# Altium project PowerPanel.PrjPcb (part 1 of 2)
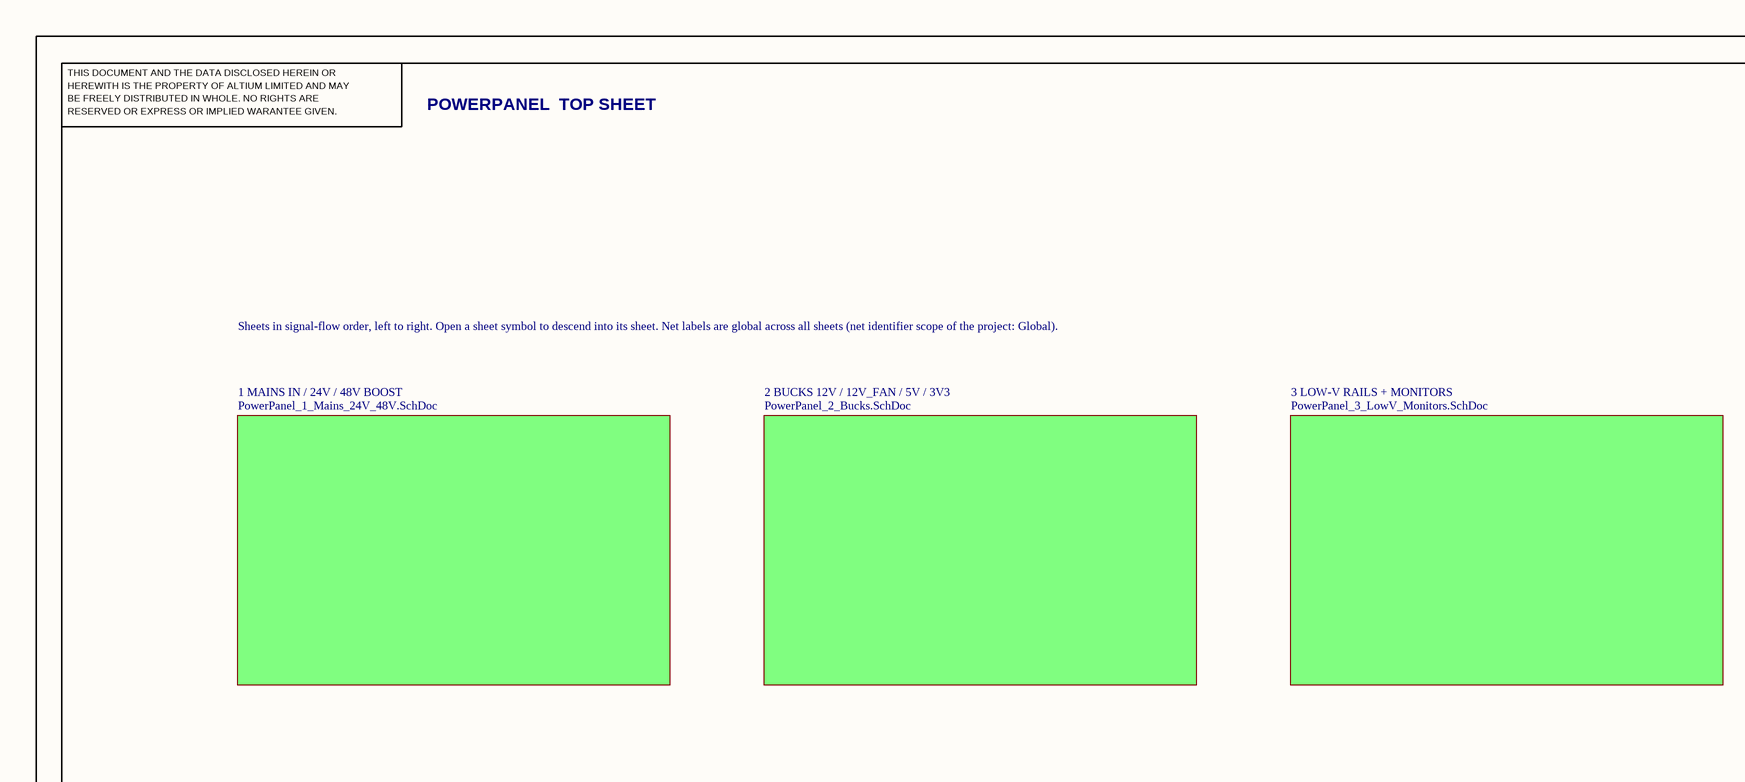
[diagram p0: PowerPanel_0_Top.SchDoc, top left]
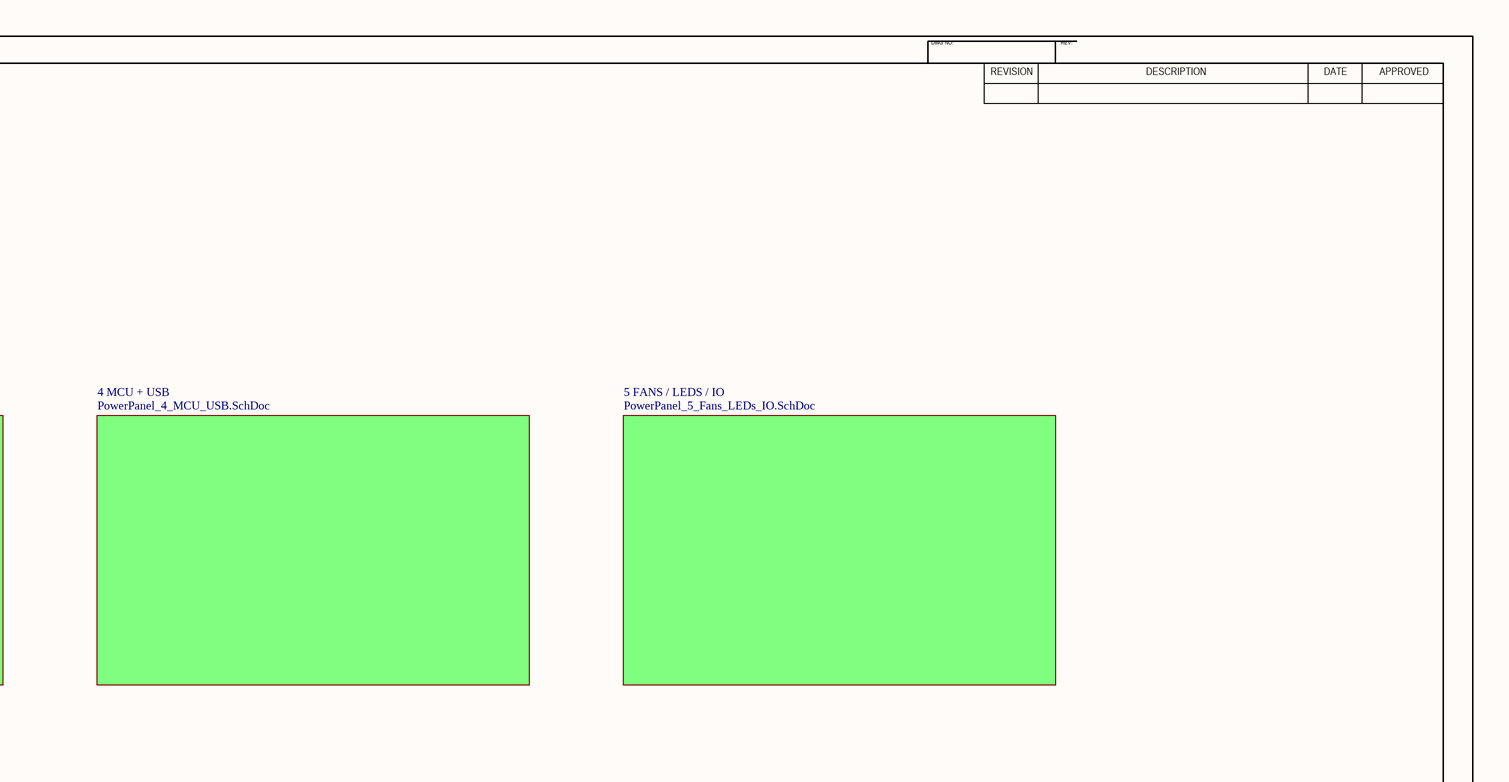
[diagram p1: PowerPanel_0_Top.SchDoc, top right]
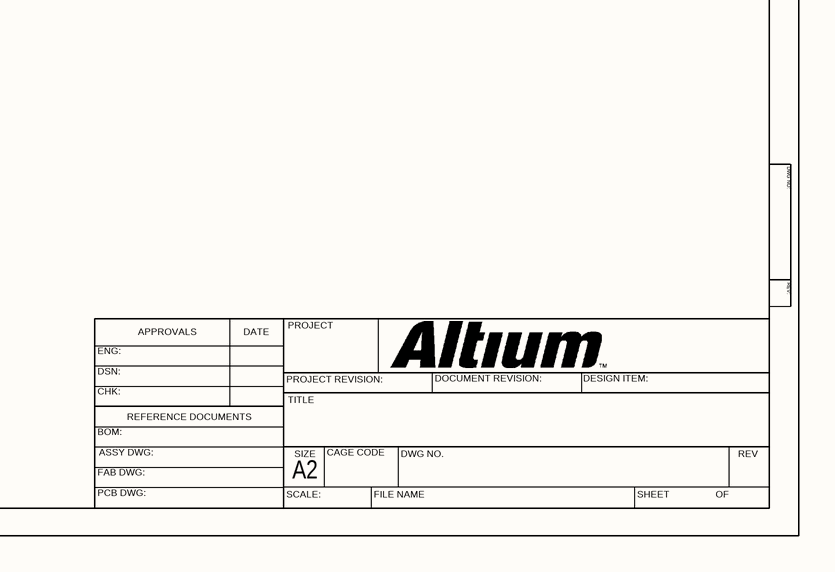
[diagram p2: PowerPanel_0_Top.SchDoc, bottom right]
6 sheets, 342 parts. Net scope: global (net labels, ports and power ports of the same name join across sheets).
Board file: PowerPanel.PcbDoc
Sheets:
  PowerPanel_0_Top.SchDoc
    1 MAINS IN / 24V / 48V BOOST = PowerPanel_1_Mains_24V_48V.SchDoc
    2 BUCKS 12V / 12V_FAN / 5V / 3V3 = PowerPanel_2_Bucks.SchDoc
    3 LOW-V RAILS + MONITORS = PowerPanel_3_LowV_Monitors.SchDoc
    4 MCU + USB = PowerPanel_4_MCU_USB.SchDoc
    5 FANS / LEDS / IO = PowerPanel_5_Fans_LEDs_IO.SchDoc

## Sheet PowerPanel_0_Top.SchDoc
size 594 x 420 mm; SheetNumber: 1; SheetTotal: 6

### Sub-sheets
1 MAINS IN / 24V / 48V BOOST = PowerPanel_1_Mains_24V_48V.SchDoc: no entries
2 BUCKS 12V / 12V_FAN / 5V / 3V3 = PowerPanel_2_Bucks.SchDoc: no entries
3 LOW-V RAILS + MONITORS = PowerPanel_3_LowV_Monitors.SchDoc: no entries
4 MCU + USB = PowerPanel_4_MCU_USB.SchDoc: no entries
5 FANS / LEDS / IO = PowerPanel_5_Fans_LEDs_IO.SchDoc: no entries

### Notes on the sheet
- DWG NO:
- REV:
- THIS DOCUMENT AND THE DATA DISCLOSED HEREIN OR
- HEREWITH IS THE PROPERTY OF ALTIUM LIMITED AND MAY
- BE FREELY DISTRIBUTED IN WHOLE. NO RIGHTS ARE
- RESERVED OR EXPRESS OR IMPLIED WARANTEE GIVEN.
- POWERPANEL  TOP SHEET
- REVISION
- DESCRIPTION
- DATE
- APPROVED
- Sheets in signal-flow order, left to right. Open a sheet symbol to descend into its sheet. Net labels are global across all sheets (net identifier scope of the project: Global).
- ENG:
- APPROVALS
- PROJECT
- DSN:
- CHK:
- REFERENCE DOCUMENTS
- PROJECT REVISION:
- TITLE
- DOCUMENT REVISION:
- DESIGN ITEM:
- BOM:
- FAB DWG:
- PCB DWG:
- ASSY DWG:
- SCALE:
- A2
- SIZE
- CAGE CODE
- FILE NAME
- DWG NO.
- SHEET
- OF
- REV

## Sheet PowerPanel_1_Mains_24V_48V.SchDoc
size 594 x 420 mm; SheetNumber: 2; SheetTotal: 6
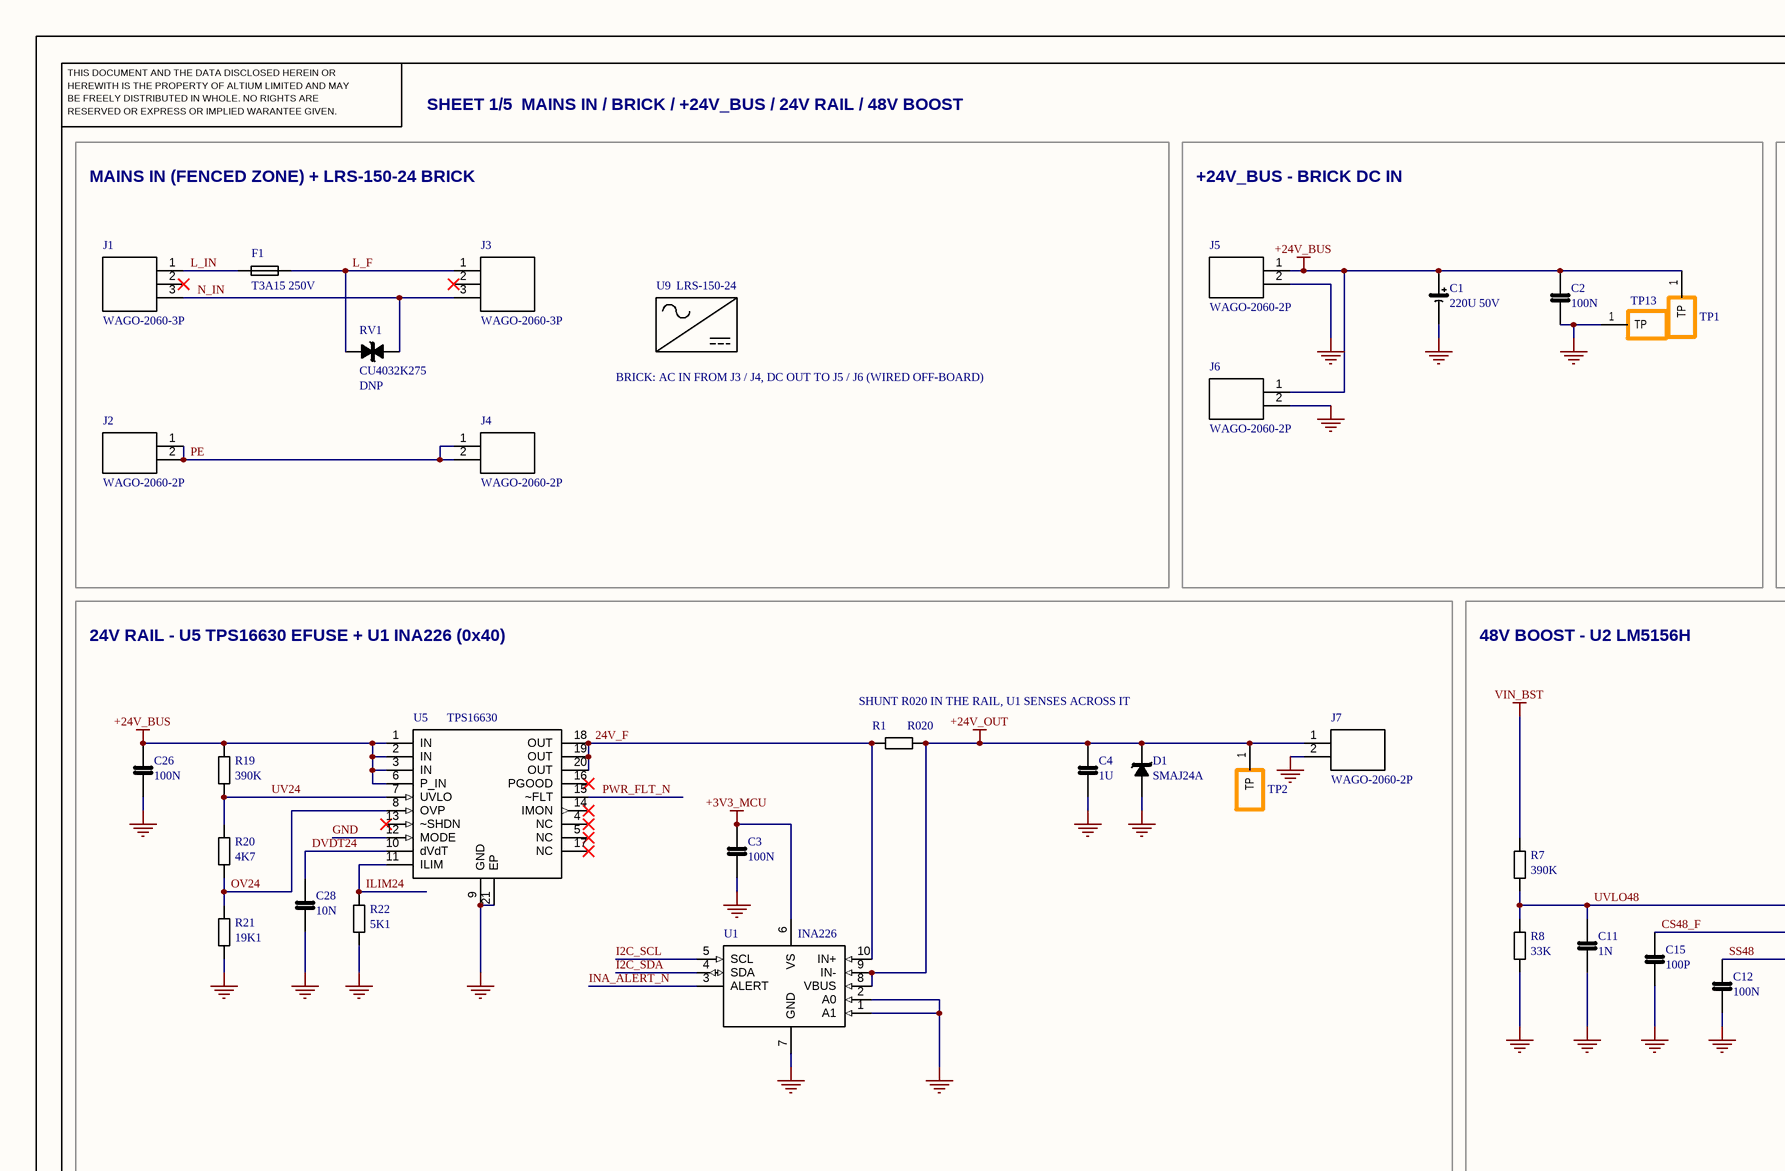
[diagram p3: PowerPanel_1_Mains_24V_48V.SchDoc, top left]
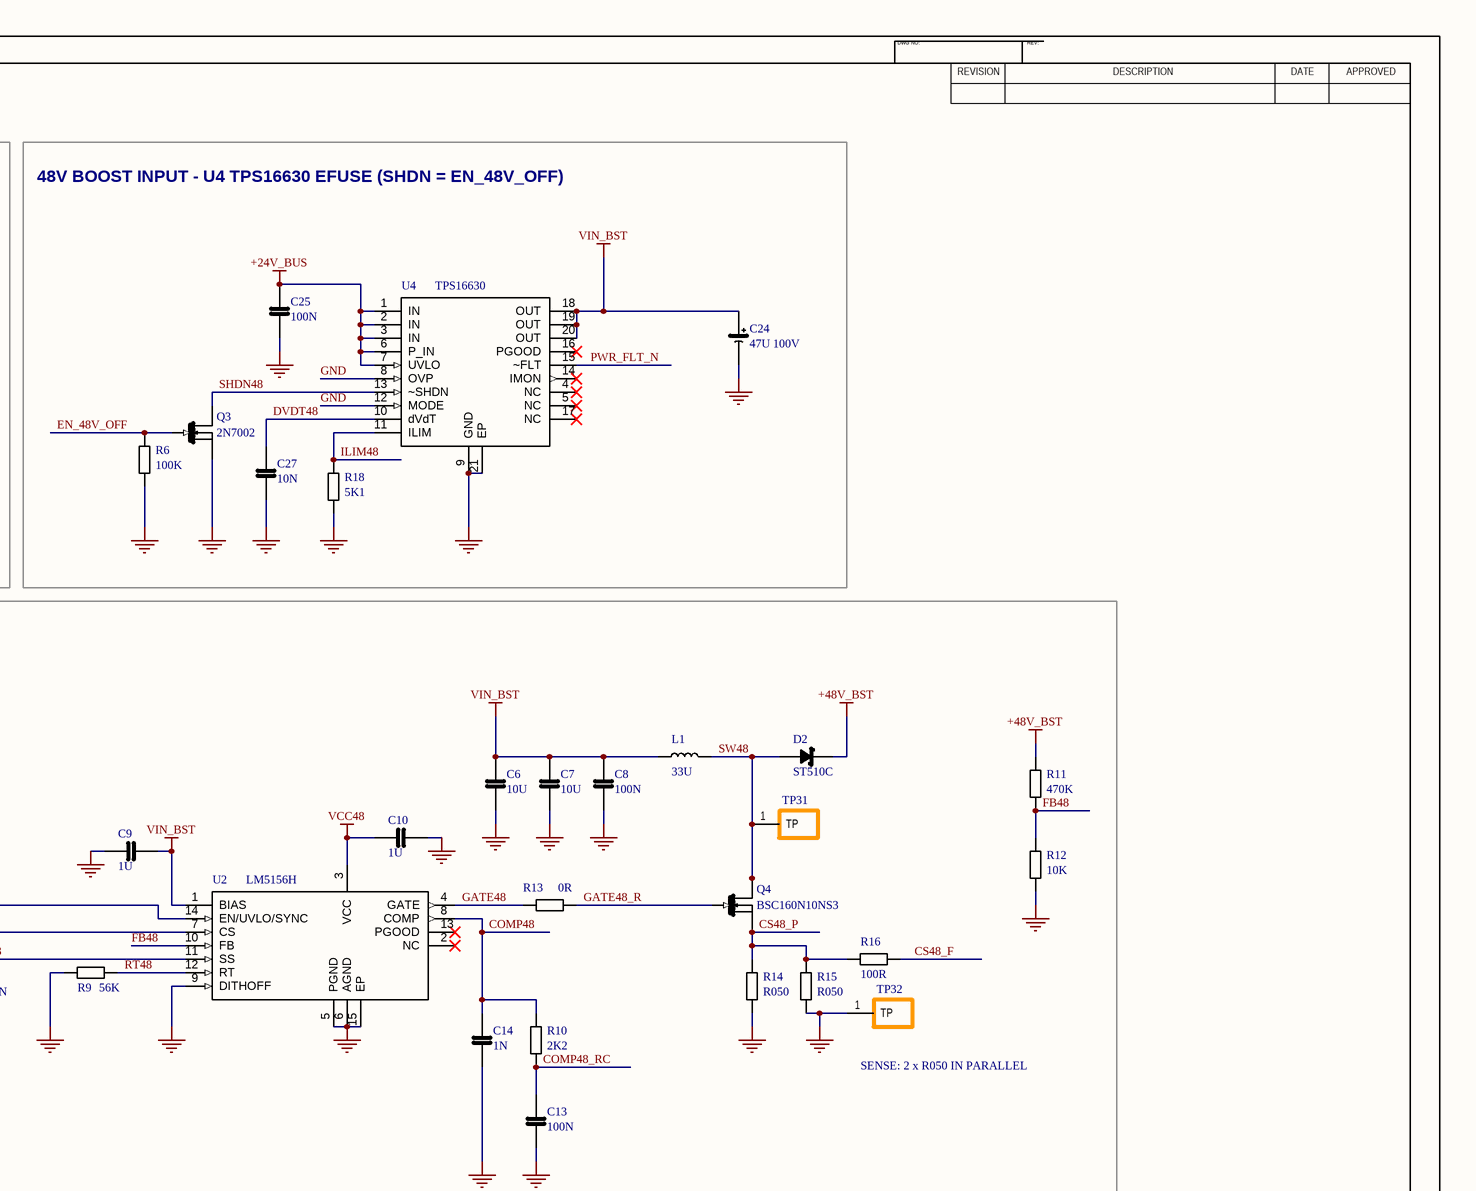
[diagram p4: PowerPanel_1_Mains_24V_48V.SchDoc, top right]
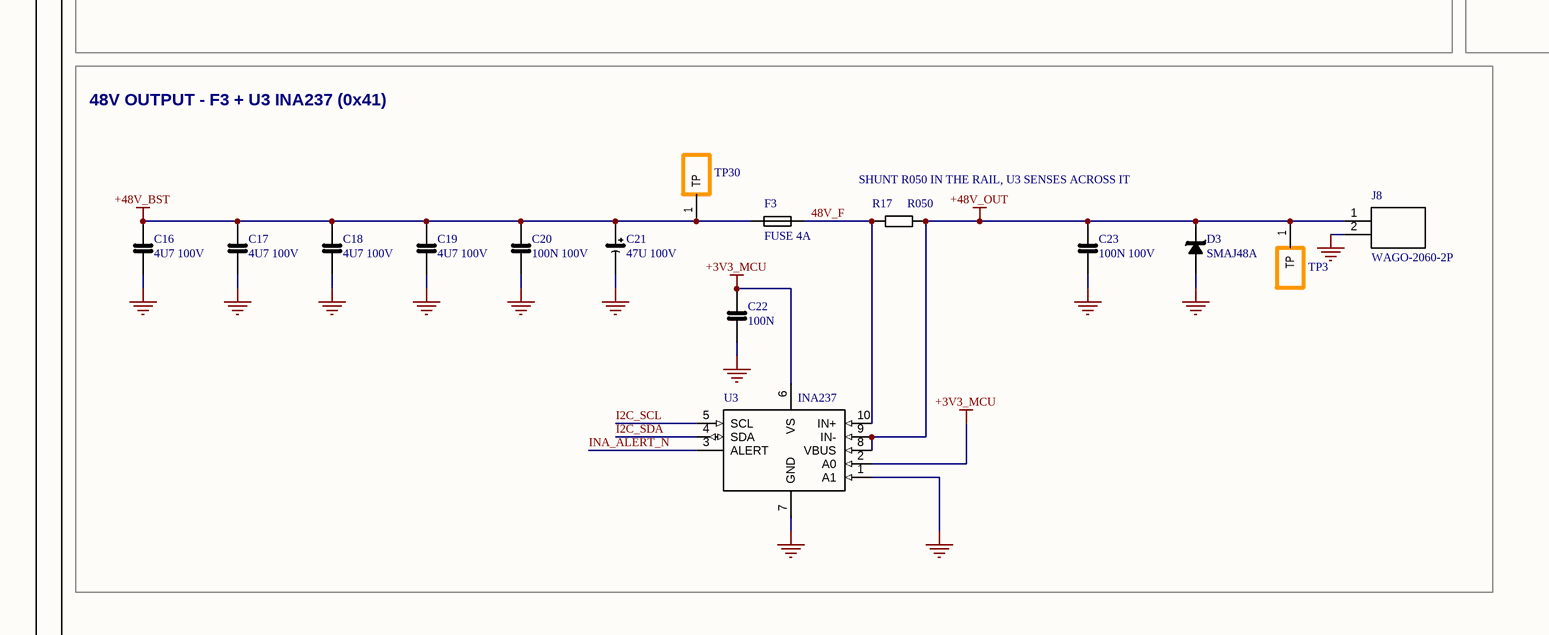
[diagram p5: PowerPanel_1_Mains_24V_48V.SchDoc, bottom left]
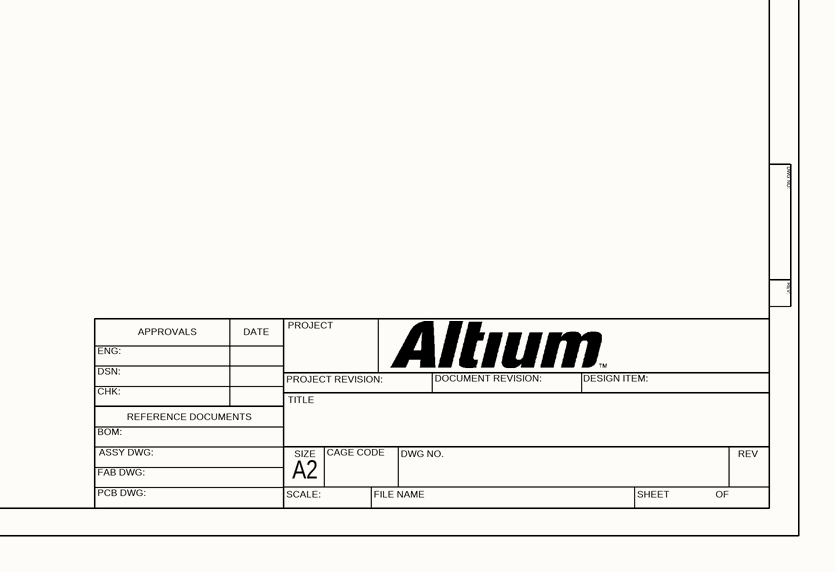
[diagram p6: PowerPanel_1_Mains_24V_48V.SchDoc, bottom right]

### Parts
C1  220U 50V  [CAPAE_D10X10.5]
C2  100N  [CAP0603]
C3  100N  [CAP0603]
C4  1U  [CAP0805]
C6  10U  [CAP1206]
C7  10U  [CAP1206]
C8  100N  [CAP0603]
C9  1U  [CAP0805]
C10  1U  [CAP0603]
C11  1N  [CAP0603]
C12  100N  [CAP0603]
C13  100N  [CAP0603]
C14  1N  [CAP0603]
C15  100P  [CAP0603]
C16  4U7 100V  [CAP1210]
C17  4U7 100V  [CAP1210]
C18  4U7 100V  [CAP1210]
C19  4U7 100V  [CAP1210]
C20  100N 100V  [CAP0603]
C21  47U 100V  [CAPAE_D8X10.5]
C22  100N  [CAP0603]
C23  100N 100V  [CAP0603]
C24  47U 100V  [CAPAE_D8X10.5]
C25  100N  [CAP0603]
C26  100N  [CAP0603]
C27  10N  [CAP0603]
C28  10N  [CAP0603]
D1  SMAJ24A  [SMA]
D2  ST510C  [SMC]
D3  SMAJ48A  [SMA]
F1  T3A15 250V  [FUSE_SCT1032]
F3  FUSE 4A  [FUSE1206]
J1  WAGO-2060-3P  [TERM_WAGO_2060-453]
J2  WAGO-2060-2P  [TERM_WAGO_2060-452]
J3  WAGO-2060-3P  [TERM_WAGO_2060-453]
J4  WAGO-2060-2P  [TERM_WAGO_2060-452]
J5  WAGO-2060-2P  [TERM_WAGO_2060-452]
J6  WAGO-2060-2P  [TERM_WAGO_2060-452]
J7  WAGO-2060-2P  [TERM_WAGO_2060-452]
J8  WAGO-2060-2P  [TERM_WAGO_2060-452]
L1  33U  [IND_MWSA1206S]
Q3  2N7002  [SOT-23-3]
Q4  BSC160N10NS3  [TDSON-8_5X6_EP]
R1  R020  [R1206]
R6  100K  [R0603]
R7  390K  [R0603]
R8  33K  [R0603]
R9  56K  [R0603]
R10  2K2  [R0603]
R11  470K  [R0603]
R12  10K  [R0603]
R13  0R  [R0603]
R14  R050  [R1206]
R15  R050  [R1206]
R16  100R  [R0603]
R17  R050  [R1206]
R18  5K1  [R0603]
R19  390K  [R0603]
R20  4K7  [R0603]
R21  19K1  [R0603]
R22  5K1  [R0603]
RV1  CU4032K275  [VAR_CU4032]
TP1  TP  [TESTPOINT]  (value not drawn)
TP2  TP  [TESTPOINT]  (value not drawn)
TP3  TP  [TESTPOINT]  (value not drawn)
TP13  TP  [TESTPOINT]  (value not drawn)
TP30  TP  [TESTPOINT]  (value not drawn)
TP31  TP  [TESTPOINT]  (value not drawn)
TP32  TP  [TESTPOINT]  (value not drawn)
U1  INA226  [MSOP-10]
U2  LM5156H  [HTSSOP-14_5X4.4_EP]
U3  INA237  [MSOP-10]
U4  TPS16630  [HTSSOP-20_6.5X4.4_EP]
U5  TPS16630  [HTSSOP-20_6.5X4.4_EP]
U9  LRS-150-24  [PSU_MW-LRS-150_CASE241A]

### Blocks framed on the sheet
MAINS IN (FENCED ZONE) + LRS-150-24 BRICK: F1 J1-J4 RV1 U9
+24V_BUS - BRICK DC IN: C1 C2 J5 J6 TP1 TP13
48V BOOST INPUT - U4 TPS16630 EFUSE (SHDN = EN_48V_OFF): C24 C25 C27 Q3 R6 R18 U4
24V RAIL - U5 TPS16630 EFUSE + U1 INA226 (0x40): C3 C4 C26 C28 D1 J7 R1 R19-R22 TP2 U1 U5
48V BOOST - U2 LM5156H: C6-C15 D2 L1 Q4 R7-R16 TP31 TP32 U2
48V OUTPUT - F3 + U3 INA237 (0x41): C16-C23 D3 F3 J8 R17 TP3 TP30 U3

### Nets
+3V3_MCU: C3.1 C22.1 U1.6(VS) U3.2(A0) U3.6(VS)
+24V_BUS: C1.1(+) C2.1 C25.1 C26.1 J5.1 J6.1 R19.1 TP1.1(TP) U4.1(IN) U4.2(IN) U4.3(IN) U4.6(P_IN) U4.7(UVLO) U5.1(IN) U5.2(IN) U5.3(IN) U5.6(P_IN)
+24V_OUT: C4.1 D1.1(K) J7.1 R1.2 TP2.1(TP) U1.8(VBUS) U1.9(IN-)
+48V_BST: C16.1 C17.1 C18.1 C19.1 C20.1 C21.1(+) D2.1(K) F3.1 R11.1 TP30.1(TP)
+48V_OUT: C23.1 D3.1(K) J8.1 R17.2 TP3.1(TP) U3.8(VBUS) U3.9(IN-)
GND: C1.2(-) C2.2 C3.2 C4.2 C6.2 C7.2 C8.2 C9.2 C10.2 C11.2 C12.2 C13.2 C14.2 C15.2 C16.2 C17.2 C18.2 C19.2 C20.2 C21.2(-) C22.2 C23.2 C24.2(-) C25.2 C26.2 C27.2 C28.2 D1.2(A) D3.2(A) J5.2 J6.2 J7.2 J8.2 Q3.2(S) R6.2 R8.2 R9.2 R12.2 R14.2 R15.2 R18.2 R21.2 R22.2 TP13.1(TP) TP32.1(TP) U1.1(A1) U1.2(A0) U1.7(GND) U2.5(PGND) U2.6(AGND) U2.9(DITHOFF) U2.15(EP) U3.1(A1) U3.7(GND) U4.8(OVP) U4.9(GND) U4.12(MODE) U4.21(EP) U5.9(GND) U5.12(MODE) U5.21(EP)
VCC48: C10.1 U2.3(VCC)
VIN_BST: C6.1 C7.1 C8.1 C9.1 C24.1(+) L1.1 R7.1 U2.1(BIAS) U4.18(OUT) U4.19(OUT) U4.20(OUT)
24V_F: R1.1 U1.10(IN+) U5.18(OUT) U5.19(OUT) U5.20(OUT)
48V_F: F3.2 R17.1 U3.10(IN+)
COMP48: C14.1 R10.1 U2.8(COMP)
COMP48_RC: C13.1 R10.2
CS48_F: C15.1 R16.2 U2.7(CS)
CS48_P: Q4.1(S) Q4.2(S) Q4.3(S) R14.1 R15.1 R16.1
DVDT24: C28.1 U5.10(dVdT)
DVDT48: C27.1 U4.10(dVdT)
EN_48V_OFF: Q3.1(G) R6.1
FB48: R11.2 R12.1 U2.10(FB)
GATE48: R13.1 U2.4(GATE)
GATE48_R: Q4.4(G) R13.2
I2C_SCL: U1.5(SCL) U3.5(SCL)
I2C_SDA: U1.4(SDA) U3.4(SDA)
ILIM24: R22.1 U5.11(ILIM)
ILIM48: R18.1 U4.11(ILIM)
INA_ALERT_N: U1.3(ALERT) U3.3(ALERT)
L_F: F1.2 J3.1 RV1.1
L_IN: F1.1 J1.1
N_IN: J1.3 J3.3 RV1.2
OV24: R20.2 R21.1 U5.8(OVP)
PE: J2.1 J2.2 J4.1 J4.2
PWR_FLT_N: U4.15(~FLT) U5.15(~FLT)
RT48: R9.1 U2.12(RT)
SHDN48: Q3.3(D) U4.13(~SHDN)
SS48: C12.1 U2.11(SS)
SW48: D2.2(A) L1.2 Q4.5(D) Q4.6(D) Q4.7(D) Q4.8(D) Q4.9(D) TP31.1(TP)
UV24: R19.2 R20.1 U5.7(UVLO)
UVLO48: C11.1 R7.2 R8.1 U2.14(EN/UVLO/SYNC)

Not connected (* = marked no-connect by the designer): J1 2*; J3 2*; U2 2(NC)* 13(PGOOD)*; U4 4(NC)* 5(NC)* 14(IMON)* 16(PGOOD)* 17(NC)*; U5 4(NC)* 5(NC)* 13(~SHDN)* 14(IMON)* 16(PGOOD)* 17(NC)*

### Notes on the sheet
- DWG NO:
- REV:
- THIS DOCUMENT AND THE DATA DISCLOSED HEREIN OR
- HEREWITH IS THE PROPERTY OF ALTIUM LIMITED AND MAY
- BE FREELY DISTRIBUTED IN WHOLE. NO RIGHTS ARE
- RESERVED OR EXPRESS OR IMPLIED WARANTEE GIVEN.
- SHEET 1/5  MAINS IN / BRICK / +24V_BUS / 24V RAIL / 48V BOOST
- REVISION
- DESCRIPTION
- DATE
- APPROVED
- (near U9) BRICK: AC IN FROM J3 / J4, DC OUT TO J5 / J6 (WIRED OFF-BOARD)
- (near R1) SHUNT R020 IN THE RAIL, U1 SENSES ACROSS IT
- (near TP32) SENSE: 2 x R050 IN PARALLEL
- (near R17) SHUNT R050 IN THE RAIL, U3 SENSES ACROSS IT
- ENG:
- APPROVALS
- PROJECT
- DSN:
- CHK:
- REFERENCE DOCUMENTS
- PROJECT REVISION:
- TITLE
- DOCUMENT REVISION:
- DESIGN ITEM:
- BOM:
- FAB DWG:
- PCB DWG:
- ASSY DWG:
- SCALE:
- A2
- SIZE
- CAGE CODE
- FILE NAME
- DWG NO.
- SHEET
- OF
- REV

### Library data of the parts
C1 = CP_220U_50V_10X10: CAP ALU // 220U // 50V // 20% // 105C // SMD D10X10.5; MFR: jieerrui; MPN: JVJ50V220M10x10; Value: 220U; LCSC: C46550417; JLC_TYPE: EXTENDED; JLC_CHECKED: 2026-10-03 STOCK 197742; Datasheet: https://www.lcsc.com/datasheet/lcsc_datasheet_2504101957_jieerrui-JVJ16V470M6x8_C46550400.pdf
C2 C3 C8 C12 C13 C22 C25 C26 = C_100N_0603: CAP // 100N // 50V // X7R // 0603; MFR: YAGEO; MPN: CC0603KRX7R9BB104; Value: 100N; LCSC: C14663; JLC_TYPE: BASIC; JLC_CHECKED: 2026-09-29 STOCK 55887132; Datasheet: https://www.lcsc.com/datasheet/lcsc_datasheet_2211101700_YAGEO-CC0603KRX7R9BB104_C14663.pdf
C4 C9 = C_1U_0805: CAP // 1U // 50V // X7R // 0805; MFR: Samsung Electro-Mechanics; MPN: CL21B105KBFNNNE; Value: 1U; LCSC: C28323; JLC_TYPE: BASIC; JLC_CHECKED: 2026-09-29 STOCK 2359989; Datasheet: https://www.lcsc.com/datasheet/lcsc_datasheet_2304140030_Samsung-Electro-Mechanics-CL21B105KBFNNNE_C28323.pdf
C6 C7 = C_10U_1206: CAP // 10U // 50V // X5R // 1206; MFR: Samsung Electro-Mechanics; MPN: CL31A106KBHNNNE; Value: 10U; LCSC: C13585; JLC_TYPE: BASIC; JLC_CHECKED: 2026-09-29 STOCK 2442079; Datasheet: https://www.lcsc.com/datasheet/lcsc_datasheet_2304140030_Samsung-Electro-Mechanics-CL31A106KBHNNNE_C13585.pdf
C10 = C_1U_0603: CAP // 1U // 50V // X5R // 0603; MFR: Samsung Electro-Mechanics; MPN: CL10A105KB8NNNC; Value: 1U; LCSC: C15849; JLC_TYPE: BASIC; JLC_CHECKED: 2026-09-29 STOCK 6435528; Datasheet: https://www.lcsc.com/datasheet/lcsc_datasheet_2304140030_Samsung-Electro-Mechanics-CL10A105KB8NNNC_C15849.pdf
C11 C14 = C_1N_0603: CAP // 1N // 50V // X7R // 0603; MFR: Samsung Electro-Mechanics; MPN: CL10B102KB8NNNC; Value: 1N; LCSC: C1588; JLC_TYPE: BASIC; JLC_CHECKED: 2026-09-29 STOCK 7937326; Datasheet: https://www.lcsc.com/datasheet/lcsc_datasheet_2304140030_Samsung-Electro-Mechanics-CL10B102KB8NNNC_C1588.pdf
C15 = C_100P_0603: CAP // 100P // 50V // C0G // 0603; MFR: Samsung Electro-Mechanics; MPN: CL10C101JB8NNNC; Value: 100P; LCSC: C14858; JLC_TYPE: BASIC; JLC_CHECKED: 2026-09-29 STOCK 4024635; Datasheet: https://www.lcsc.com/datasheet/lcsc_datasheet_2304140030_Samsung-Electro-Mechanics-CL10C101JB8NNNC_C14858.pdf
C16-C19 = C_4U7_100V_1210: CAP // 4U7 // 100V // X7R // 1210; MFR: PSA(Prosperity Dielectrics); MPN: FS32X475K101EGG; Value: 4U7; LCSC: C381466; JLC_TYPE: EXTENDED; JLC_CHECKED: 2026-10-03 STOCK 171506; Datasheet: https://wmsc.lcsc.com/wmsc/upload/file/pdf/v2/lcsc/2304140030_PSA-Prosperity-Dielectrics-FS32X475K101EGG_C381466.pdf
C20 C23 = C_100N_100V_0603: CAP // 100N // 100V // X7R // 0603; MFR: Samsung Electro-Mechanics; MPN: CL10B104KC8NNNC; Value: 100N; LCSC: C15725; JLC_TYPE: EXTENDED; JLC_CHECKED: 2026-10-03 STOCK 692214; Datasheet: https://www.lcsc.com/datasheet/lcsc_datasheet_2304140030_Samsung-Electro-Mechanics-CL10B104KC8NNNC_C15725.pdf
C21 C24 = CP_47U_100V_8X10: CAP ALU // 47U // 100V // 20% // 105C // SMD D8X10.5; MFR: jieerrui; MPN: RV100V47M8X10; Value: 47U; LCSC: C48935391; JLC_TYPE: EXTENDED; JLC_CHECKED: 2026-10-03 STOCK 115676; Datasheet: https://www.lcsc.com/datasheet/lcsc_datasheet_2505151725_jieerrui-RV100V47M8X10_C48935391.pdf
C27 C28 = C_10N_0603: CAP // 10N // 50V // X7R // 0603; MFR: FH (Guangdong Fenghua Advanced Tech); MPN: 0603B103K500NT; Value: 10N; LCSC: C57112; JLC_TYPE: BASIC; JLC_CHECKED: 2026-09-29 STOCK 6903861; Datasheet: https://www.lcsc.com/datasheet/lcsc_datasheet_2304140030_FH--Guangdong-Fenghua-Advanced-Tech-0603B103K500NT_C57112.pdf
D1 = D_SMAJ24A: TVS // 24V UNI // 400W // 38V9 CLAMP // SMA; MFR: hongjiacheng; Value: 24V; MPN: SMAJ24A; LCSC: C19077541; JLC_TYPE: PREFERRED; JLC_CHECKED: 2026-09-29 STOCK 132041; Datasheet: https://wmsc.lcsc.com/wmsc/upload/file/pdf/v2/lcsc/2312280937_hongjiacheng-SMAJ24A_C19077541.pdf
D2 = D_ST510C: SCHOTTKY // 100V 5A // 600MV // 150A IFSM // SMC; MFR: MDD (Microdiode Semiconductor); Value: 100V 5A; MPN: ST510C; LCSC: C414013; JLC_TYPE: EXTENDED; JLC_CHECKED: 2026-10-03 STOCK 2060; Datasheet: https://www.lcsc.com/datasheet/lcsc_datasheet_2408090958_MDD-Microdiode-Semiconductor-ST510C_C414013.pdf
D3 = D_SMAJ48A: TVS // 48V UNI // 400W // 77V4 CLAMP // SMA; MFR: Littelfuse; Value: 48V; MPN: SMAJ48A; LCSC: C223991; JLC_TYPE: EXTENDED; JLC_CHECKED: 2026-10-03 STOCK 5668; Datasheet: https://www.lcsc.com/datasheet/lcsc_datasheet_2304140030_Littelfuse-SMAJ48A_C223991.pdf
F1 = F_T3A15_250V_1032: FUSE // T3.15A TIME-LAG // 250VAC // 100A BREAK // SMD 10.3X3.3; MFR: SETsafe / SETfuse; MPN: SCT1032T3.15A250V; Value: 3A15; LCSC: C19712564; JLC_TYPE: EXTENDED; JLC_CHECKED: 2026-10-03 STOCK 1944; Datasheet: https://wmsc.lcsc.com/wmsc/upload/file/pdf/v2/lcsc/2312181522_SETsafe--/--SETfuse-SCT1032T3-15A250V_C19712564.pdf
F3 = F_4A_63V_1206: FUSE // 4A // FAST // 63V // 50A BREAK // 1206; MFR: Shenzhen JDT Fuse; MPN: JFC1206-1400FS; Value: 4A; LCSC: C136349; JLC_TYPE: EXTENDED; JLC_CHECKED: 2026-10-03 STOCK 45560; Datasheet: https://www.lcsc.com/datasheet/lcsc_datasheet_2305151206_Shenzhen-JDT-Fuse-JFC1206-1400FS_C136349.pdf
J1 J3 = J_TERM-SPRING_3P_4.0_SMD: CONN // WAGO 2060 PUSH-IN // 3P // 4.0MM // 9A 320V // SMD; MPN: 2060-453/998-404; Value: 3P; MFR: WAGO; LCSC: C2765056; JLC_TYPE: EXTENDED; JLC_CHECKED: 2026-10-03 STOCK 1543; Datasheet: https://wmsc.lcsc.com/wmsc/upload/file/pdf/v2/lcsc/2106061734_WAGO-2060-453-998-404_C2765056.pdf
J2 J4-J8 = J_TERM-SPRING_2P_4.0_SMD: CONN // WAGO 2060 PUSH-IN // 2P // 4.0MM // 9A 320V // SMD; MPN: 2060-452/998-404; Value: 2P; MFR: WAGO; LCSC: C2765055; JLC_TYPE: EXTENDED; JLC_CHECKED: 2026-10-03 STOCK 27983; Datasheet: https://wmsc.lcsc.com/wmsc/upload/file/pdf/v2/lcsc/2410121253_WAGO-2060-452-998-404_C2765055.pdf
L1 = L_33U_1350: IND // 33U // ISAT 4.8A // IRMS 4.8A // 75MR // 1350 MOLDED; MFR: Sunlord; MPN: MWSA1206S-330MT; Value: 33U; LCSC: C408530; JLC_TYPE: EXTENDED; JLC_CHECKED: 2026-10-03 STOCK 2989; Datasheet: https://media.digikey.com/pdf/Data%20Sheets/Shenzhen%20Sunlord/MWSA-S_Series_DS.pdf
Q3 = Q_2N7002: NMOS // 60V // 115MA // 5R@10V // SOT-23; MFR: Jiangsu Changjing Electronics Technology Co., Ltd.; Value: 2N7002; MPN: 2N7002; LCSC: C8545; JLC_TYPE: BASIC; JLC_CHECKED: 2026-09-29 STOCK 1679919; Datasheet: https://www.lcsc.com/datasheet/lcsc_datasheet_2304140030_Jiangsu-Changjing-Electronics-Technology-Co---Ltd--2N7002_C8545.pdf
Q4 = Q_BSC160N10NS3G: NMOS // 100V // 42A // 16MR@10V // TDSON-8 5X6; MFR: Infineon Technologies; Value: BSC160N10NS3G; MPN: BSC160N10NS3 G; LCSC: C148261; JLC_TYPE: EXTENDED; JLC_CHECKED: 2026-10-03 STOCK 3614; Datasheet: https://www.lcsc.com/datasheet/lcsc_datasheet_2304140030_Infineon-Technologies-BSC160N10NS3G_C148261.pdf
R1 = R_R020_1206: SHUNT // R020 // 1% // 1W // 70PPM // 1206; MFR: PSA(Prosperity Dielectrics); MPN: FMF06FTHR020-LH; Value: R020; LCSC: C371097; JLC_TYPE: EXTENDED; JLC_CHECKED: 2026-10-03 STOCK 16724; Datasheet: https://www.lcsc.com/datasheet/lcsc_datasheet_2304140030_PSA-Prosperity-Dielectrics-FMF06FTHR020-LH_C371097.pdf
R6 = R_100K_0603: RES // 100K // 1% // 100MW // 0603; MFR: UNI-ROYAL(Uniroyal Elec); MPN: 0603WAF1003T5E; Value: 100K; LCSC: C25803; JLC_TYPE: BASIC; JLC_CHECKED: 2026-09-29 STOCK 22429301; Datasheet: https://www.lcsc.com/datasheet/lcsc_datasheet_2206010045_UNI-ROYAL-Uniroyal-Elec-0603WAF1003T5E_C25803.pdf
R7 R19 = R_390K_0603: RES // 390K // 1% // 100MW // 0603; MFR: UNI-ROYAL(Uniroyal Elec); MPN: 0603WAF3903T5E; Value: 390K; LCSC: C23150; JLC_TYPE: PREFERRED; JLC_CHECKED: 2026-10-03 STOCK 76545; Datasheet: https://www.lcsc.com/datasheet/lcsc_datasheet_2206010116_UNI-ROYAL-Uniroyal-Elec-0603WAF3903T5E_C23150.pdf
R8 = R_33K_0603: RES // 33K // 1% // 100MW // 0603; MFR: UNI-ROYAL(Uniroyal Elec); MPN: 0603WAF3302T5E; Value: 33K; LCSC: C4216; JLC_TYPE: BASIC; JLC_CHECKED: 2026-10-03 STOCK 3235651; Datasheet: https://www.lcsc.com/datasheet/lcsc_datasheet_2206010230_UNI-ROYAL-Uniroyal-Elec-0603WAF3302T5E_C4216.pdf
R9 = R_56K_0603: RES // 56K // 1% // 100MW // 0603; MFR: UNI-ROYAL(Uniroyal Elec); MPN: 0603WAF5602T5E; Value: 56K; LCSC: C23206; JLC_TYPE: BASIC; JLC_CHECKED: 2026-10-03 STOCK 1024608; Datasheet: https://www.lcsc.com/datasheet/lcsc_datasheet_2206010116_UNI-ROYAL-Uniroyal-Elec-0603WAF5602T5E_C23206.pdf
R10 = R_2K2_0603: RES // 2K2 // 1% // 100MW // 0603; MFR: UNI-ROYAL(Uniroyal Elec); MPN: 0603WAF2201T5E; Value: 2K2; LCSC: C4190; JLC_TYPE: BASIC; JLC_CHECKED: 2026-09-29 STOCK 7718232; Datasheet: https://www.lcsc.com/datasheet/lcsc_datasheet_2206010230_UNI-ROYAL-Uniroyal-Elec-0603WAF2201T5E_C4190.pdf
R11 = R_470K_0603: RES // 470K // 1% // 100MW // 0603; MFR: UNI-ROYAL(Uniroyal Elec); MPN: 0603WAF4703T5E; Value: 470K; LCSC: C23178; JLC_TYPE: BASIC; JLC_CHECKED: 2026-10-03 STOCK 1456053; Datasheet: https://www.lcsc.com/datasheet/lcsc_datasheet_2206010116_UNI-ROYAL-Uniroyal-Elec-0603WAF4703T5E_C23178.pdf
R12 = R_10K_0603: RES // 10K // 1% // 100MW // 0603; MFR: UNI-ROYAL(Uniroyal Elec); MPN: 0603WAF1002T5E; Value: 10K; LCSC: C25804; JLC_TYPE: BASIC; JLC_CHECKED: 2026-09-29 STOCK 21309815; Datasheet: https://www.lcsc.com/datasheet/lcsc_datasheet_2206010045_UNI-ROYAL-Uniroyal-Elec-0603WAF1002T5E_C25804.pdf
R13 = R_0R_0603: RES // 0R // JUMPER // 0603; MFR: UNI-ROYAL(Uniroyal Elec); MPN: 0603WAF0000T5E; Value: 0R; LCSC: C21189; JLC_TYPE: BASIC; JLC_CHECKED: 2026-09-29 STOCK 24079380; Datasheet: https://www.lcsc.com/datasheet/lcsc_datasheet_2411221126_UNI-ROYAL-Uniroyal-Elec-0603WAF0000T5E_C21189.pdf
R14 R15 R17 = R_R050_1206: SHUNT // R050 // 1% // 1W // 1206; MFR: Shenzhen Yezhan Elec.; MPN: YLRY06-1-50F; Value: R050; LCSC: C20608719; JLC_TYPE: EXTENDED; JLC_CHECKED: 2026-09-29 STOCK 79173; Datasheet: https://wmsc.lcsc.com/wmsc/upload/file/pdf/v2/lcsc/2401171159_Shenzhen-Yezhan-Elec--YLRY06-1-50F_C20608719.pdf
R16 = R_100R_0603: RES // 100R // 1% // 100MW // 0603; MFR: UNI-ROYAL(Uniroyal Elec); MPN: 0603WAF1000T5E; Value: 100R; LCSC: C22775; JLC_TYPE: BASIC; JLC_CHECKED: 2026-09-29 STOCK 11791812; Datasheet: https://www.lcsc.com/datasheet/lcsc_datasheet_2411221126_UNI-ROYAL-Uniroyal-Elec-0603WAF1000T5E_C22775.pdf
R18 R22 = R_5K1_0603: RES // 5K1 // 1% // 100MW // 0603; MFR: UNI-ROYAL(Uniroyal Elec); MPN: 0603WAF5101T5E; Value: 5K1; LCSC: C23186; JLC_TYPE: BASIC; JLC_CHECKED: 2026-09-29 STOCK 25577365; Datasheet: https://www.lcsc.com/datasheet/lcsc_datasheet_2206010116_UNI-ROYAL-Uniroyal-Elec-0603WAF5101T5E_C23186.pdf
R20 = R_4K7_0603: RES // 4K7 // 1% // 100MW // 0603; MFR: UNI-ROYAL(Uniroyal Elec); MPN: 0603WAF4701T5E; Value: 4K7; LCSC: C23162; JLC_TYPE: BASIC; JLC_CHECKED: 2026-09-29 STOCK 22752027; Datasheet: https://www.lcsc.com/datasheet/lcsc_datasheet_2206010116_UNI-ROYAL-Uniroyal-Elec-0603WAF4701T5E_C23162.pdf
R21 = R_19K1_0603: RES // 19K1 // 1% // 100MW // 0603; MFR: UNI-ROYAL(Uniroyal Elec); MPN: 0603WAF1912T5E; Value: 19K1; LCSC: C22897; JLC_TYPE: EXTENDED; JLC_CHECKED: 2026-10-03 STOCK 64956; Datasheet: https://www.lcsc.com/datasheet/lcsc_datasheet_2206010130_UNI-ROYAL-Uniroyal-Elec-0603WAF1912T5E_C22897.pdf
RV1 = RV_275VAC_SMD10X8: VARISTOR // 430V // 275VAC 350VDC // 1K2A // 710V CLAMP // SMD 10.2X8; MFR: TDK; MPN: B72660M0271K072; Value: 430V; LCSC: C211138; JLC_TYPE: EXTENDED; JLC_CHECKED: 2026-10-03 STOCK 955; Datasheet: https://wmsc.lcsc.com/wmsc/upload/file/pdf/v2/lcsc/2406141752_TDK-B72660M0271K072_C211138.pdf; DNP: DNP
TP1-TP3 TP13 TP30-TP32 = TP: TP // SMD PAD // 1.5MM; MPN: TEST POINT (NOT A BOM PART)
U1 = U_INA226: PWR MON // 36V // 16BIT I2C // ALERT // VSSOP-10; MFR: Texas Instruments; MPN: INA226AIDGSR; Value: INA226; LCSC: C49851; JLC_TYPE: EXTENDED; JLC_CHECKED: 2026-09-29 STOCK 48191; Datasheet: https://www.lcsc.com/datasheet/lcsc_datasheet_2312041157_Texas-Instruments-INA226AIDGSR_C49851.pdf
U2 = U_LM5156H: BOOST CTRL // 2V97-60V // 100K-2M2HZ // NON-HICCUP // HTSSOP-14; MFR: Texas Instruments; MPN: LM5156HPWPR; Value: LM5156H; LCSC: C2867852; JLC_TYPE: EXTENDED; JLC_CHECKED: 2026-10-03 STOCK 3172; Datasheet: https://www.ti.com/lit/ds/symlink/lm5156h.pdf
U3 = U_INA237: PWR MON // 85V // 16BIT I2C // ALERT // VSSOP-10; MFR: Texas Instruments; MPN: INA237AIDGSR; Value: INA237; LCSC: C2864837; JLC_TYPE: EXTENDED; JLC_CHECKED: 2026-10-03 STOCK 5235; Datasheet: https://www.ti.com/lit/ds/symlink/ina237.pdf
U4 U5 = U_TPS16630PWP: EFUSE // 4V5-60V // 6A // 31MR // UVLO OVP // HTSSOP-20; MFR: Texas Instruments; MPN: TPS16630PWPR; Value: TPS16630; LCSC: C1849461; JLC_TYPE: EXTENDED; JLC_CHECKED: 2026-10-03 STOCK 1141; Datasheet: https://www.ti.com/lit/ds/symlink/tps1663.pdf
U9 = PSU_LRS-150-24: PSU // AC-DC // 24V 6.5A // 150W // CASE 241A 159X97X30 // HAND FITTED; MFR: Mean Well; Value: 24V 150W; Assembly: HAND - BOUGHT SEPARATELY, SCREWED ON + WIRED AFTER PCBA (NOT JLC); BOM_Extra: KAPTON SHEET >=165X103X0.1MM UNDER THE BRICK + 2X M3X4 SCREWS (WAFER HEAD OR ISO 10642, A-HV5); MPN: LRS-150-24; Datasheet: https://www.meanwell.com/Upload/PDF/LRS-150/LRS-150-SPEC.PDF

## Sheet PowerPanel_2_Bucks.SchDoc
size 594 x 420 mm; SheetNumber: 3; SheetTotal: 6
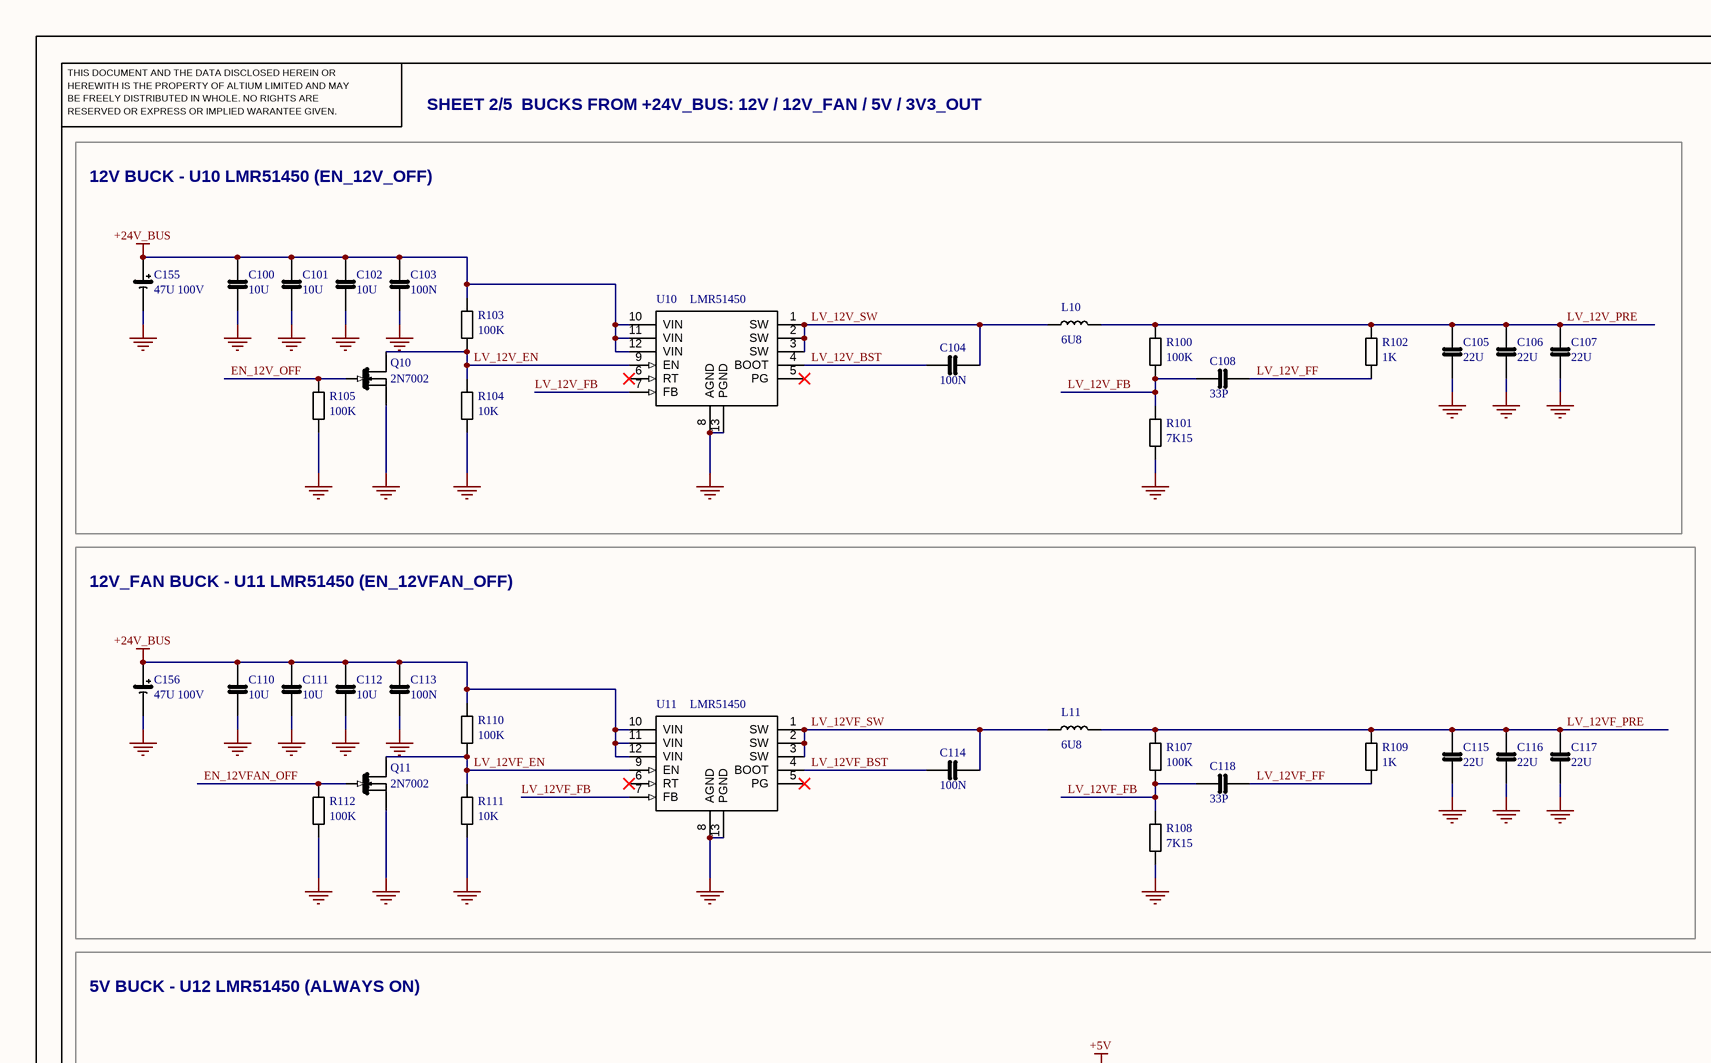
[diagram p7: PowerPanel_2_Bucks.SchDoc, top left]
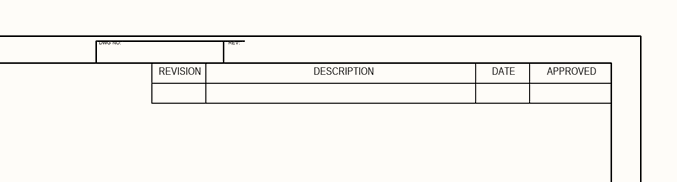
[diagram p8: PowerPanel_2_Bucks.SchDoc, top right]
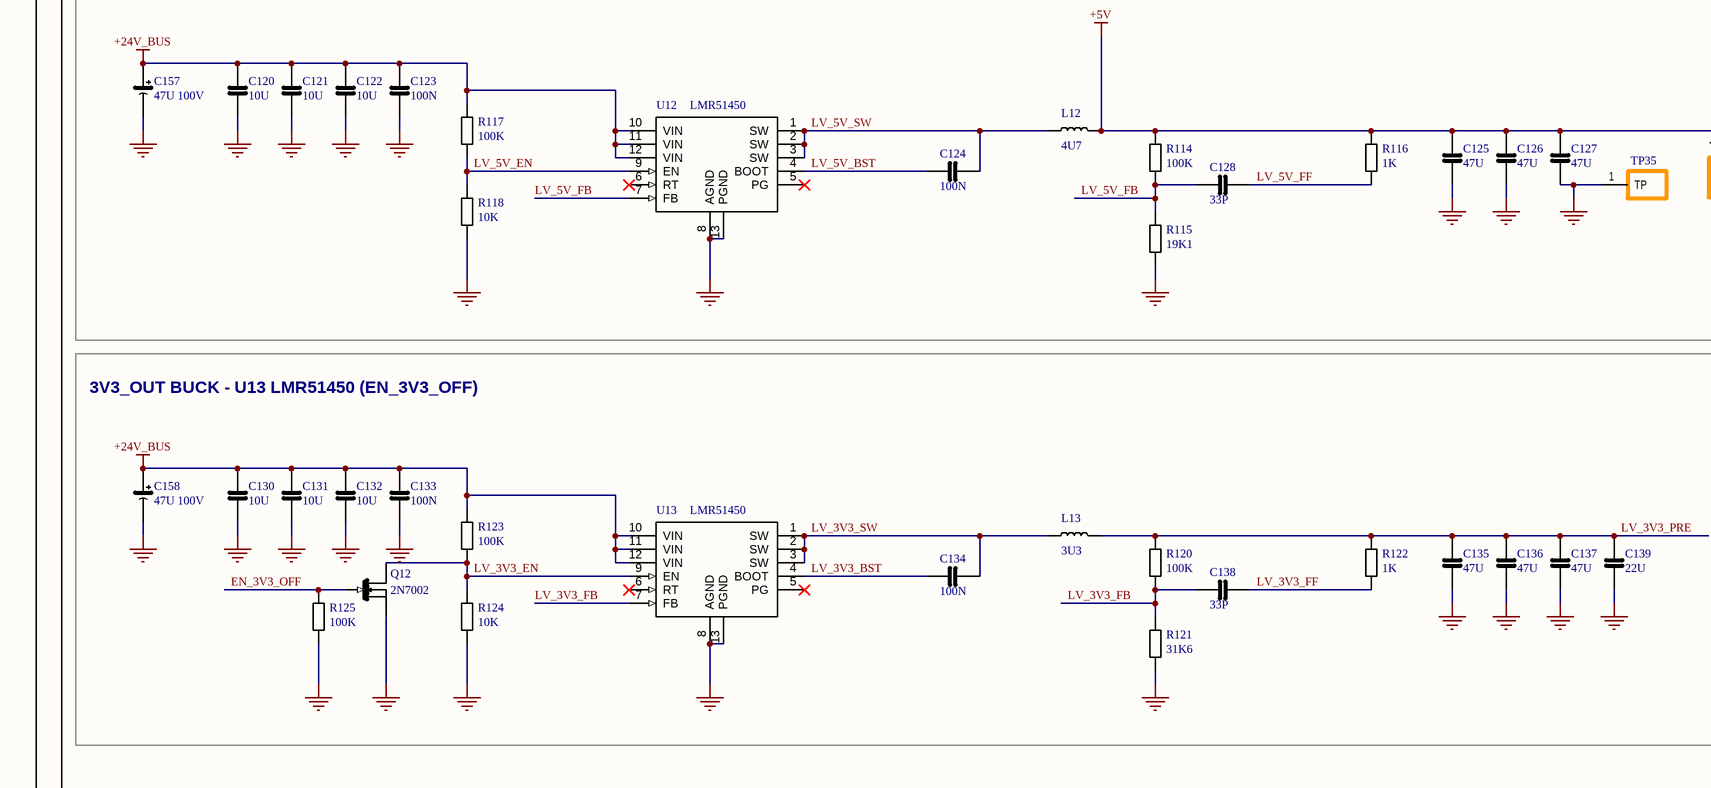
[diagram p9: PowerPanel_2_Bucks.SchDoc, bottom left]
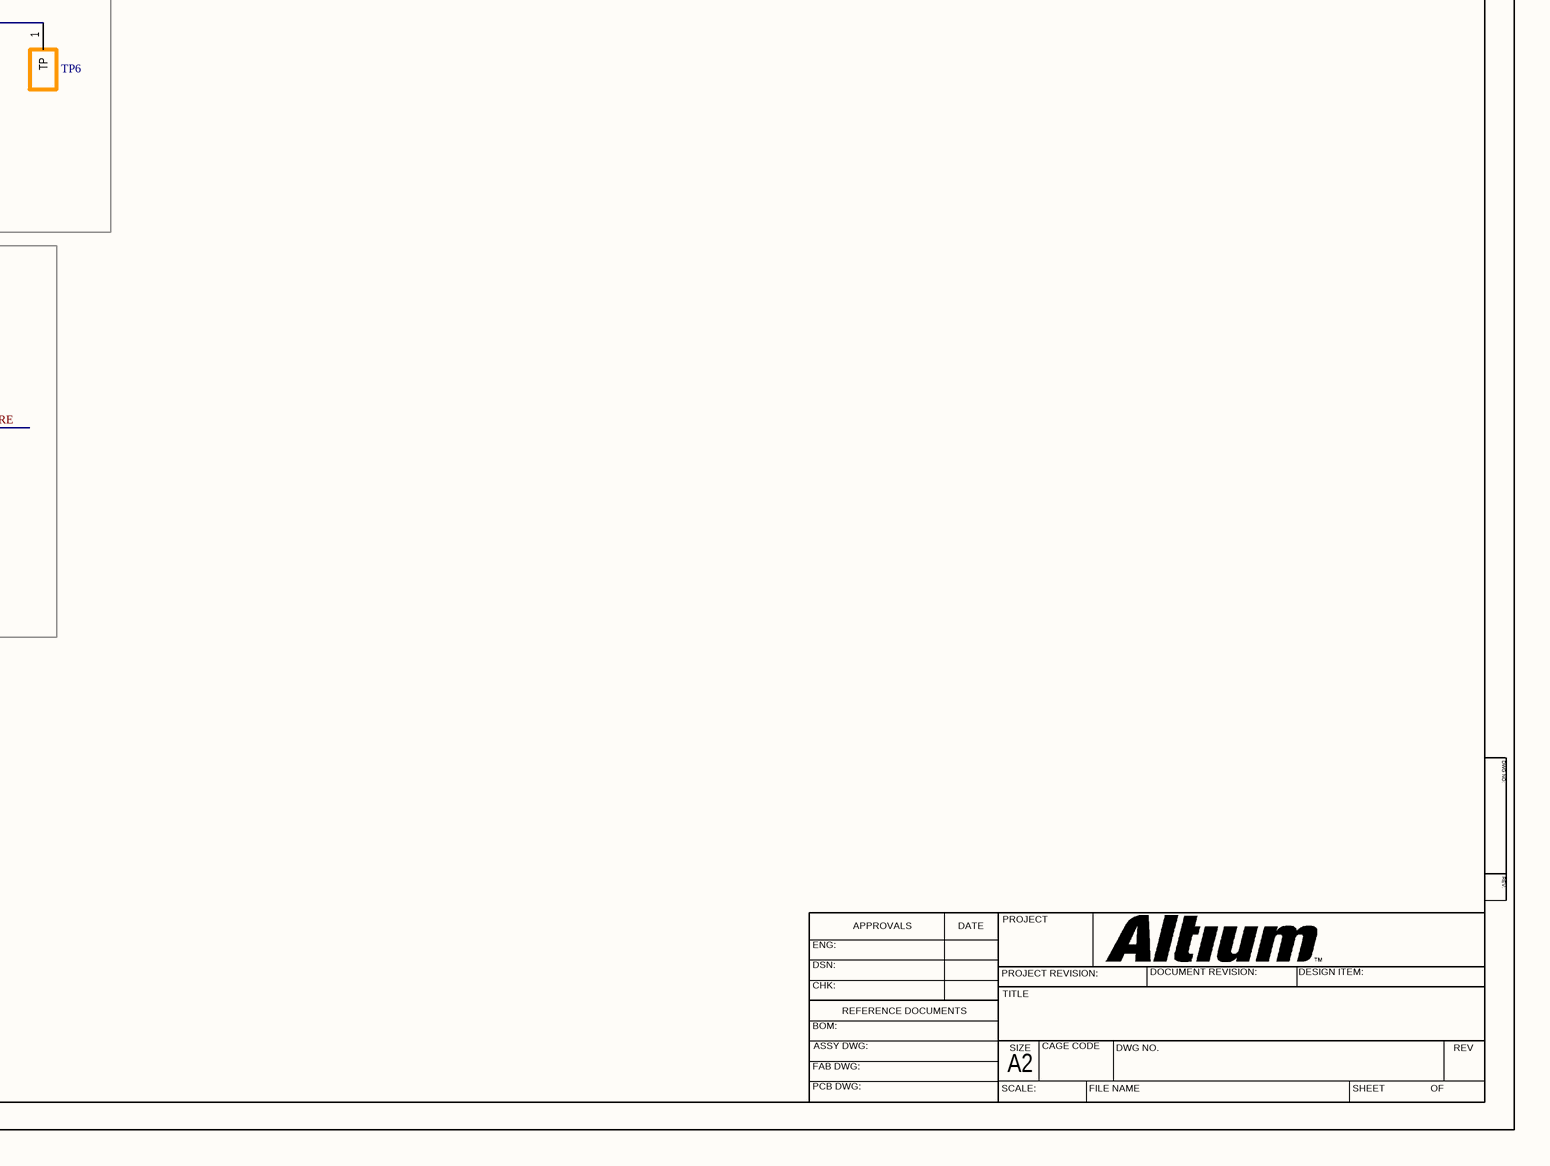
[diagram p10: PowerPanel_2_Bucks.SchDoc, bottom right]

### Parts
C100  10U  [CAP1206]
C101  10U  [CAP1206]
C102  10U  [CAP1206]
C103  100N  [CAP0603]
C104  100N  [CAP0603]
C105  22U  [CAP1206]
C106  22U  [CAP1206]
C107  22U  [CAP1206]
C108  33P  [CAP0603]
C110  10U  [CAP1206]
C111  10U  [CAP1206]
C112  10U  [CAP1206]
C113  100N  [CAP0603]
C114  100N  [CAP0603]
C115  22U  [CAP1206]
C116  22U  [CAP1206]
C117  22U  [CAP1206]
C118  33P  [CAP0603]
C120  10U  [CAP1206]
C121  10U  [CAP1206]
C122  10U  [CAP1206]
C123  100N  [CAP0603]
C124  100N  [CAP0603]
C125  47U  [CAP1206]
C126  47U  [CAP1206]
C127  47U  [CAP1206]
C128  33P  [CAP0603]
C130  10U  [CAP1206]
C131  10U  [CAP1206]
C132  10U  [CAP1206]
C133  100N  [CAP0603]
C134  100N  [CAP0603]
C135  47U  [CAP1206]
C136  47U  [CAP1206]
C137  47U  [CAP1206]
C138  33P  [CAP0603]
C139  22U  [CAP0805]
C155  47U 100V  [CAPAE_D8X10.5]
C156  47U 100V  [CAPAE_D8X10.5]
C157  47U 100V  [CAPAE_D8X10.5]
C158  47U 100V  [CAPAE_D8X10.5]
L10  6U8  [IND_FXL1040]
L11  6U8  [IND_FXL1040]
L12  4U7  [IND_FXL1040]
L13  3U3  [IND_FXL1040]
Q10  2N7002  [SOT-23-3]
Q11  2N7002  [SOT-23-3]
Q12  2N7002  [SOT-23-3]
R100  100K  [R0603]
R101  7K15  [R0603]
R102  1K  [R0603]
R103  100K  [R0603]
R104  10K  [R0603]
R105  100K  [R0603]
R107  100K  [R0603]
R108  7K15  [R0603]
R109  1K  [R0603]
R110  100K  [R0603]
R111  10K  [R0603]
R112  100K  [R0603]
R114  100K  [R0603]
R115  19K1  [R0603]
R116  1K  [R0603]
R117  100K  [R0603]
R118  10K  [R0603]
R120  100K  [R0603]
R121  31K6  [R0603]
R122  1K  [R0603]
R123  100K  [R0603]
R124  10K  [R0603]
R125  100K  [R0603]
TP6  TP  [TESTPOINT]  (value not drawn)
TP35  TP  [TESTPOINT]  (value not drawn)
U10  LMR51450  [WSON-12_3X3_EP]
U11  LMR51450  [WSON-12_3X3_EP]
U12  LMR51450  [WSON-12_3X3_EP]
U13  LMR51450  [WSON-12_3X3_EP]

### Blocks framed on the sheet
12V BUCK - U10 LMR51450 (EN_12V_OFF): C100-C108 C155 L10 Q10 R100-R105 U10
12V_FAN BUCK - U11 LMR51450 (EN_12VFAN_OFF): C110-C118 C156 L11 Q11 R107-R112 U11
5V BUCK - U12 LMR51450 (ALWAYS ON): C120-C128 C157 L12 R114-R118 TP6 TP35 U12
3V3_OUT BUCK - U13 LMR51450 (EN_3V3_OFF): C130-C139 C158 L13 Q12 R120-R125 U13

### Nets
+5V: C125.1 C126.1 C127.1 L12.2 R114.1 R116.1 TP6.1(TP)
+24V_BUS: C100.1 C101.1 C102.1 C103.1 C110.1 C111.1 C112.1 C113.1 C120.1 C121.1 C122.1 C123.1 C130.1 C131.1 C132.1 C133.1 C155.1(+) C156.1(+) C157.1(+) C158.1(+) R103.1 R110.1 R117.1 R123.1 U10.10(VIN) U10.11(VIN) U10.12(VIN) U11.10(VIN) U11.11(VIN) U11.12(VIN) U12.10(VIN) U12.11(VIN) U12.12(VIN) U13.10(VIN) U13.11(VIN) U13.12(VIN)
GND: C100.2 C101.2 C102.2 C103.2 C105.2 C106.2 C107.2 C110.2 C111.2 C112.2 C113.2 C115.2 C116.2 C117.2 C120.2 C121.2 C122.2 C123.2 C125.2 C126.2 C127.2 C130.2 C131.2 C132.2 C133.2 C135.2 C136.2 C137.2 C139.2 C155.2(-) C156.2(-) C157.2(-) C158.2(-) Q10.2(S) Q11.2(S) Q12.2(S) R101.2 R104.2 R105.2 R108.2 R111.2 R112.2 R115.2 R118.2 R121.2 R124.2 R125.2 TP35.1(TP) U10.8(AGND) U10.13(PGND) U11.8(AGND) U11.13(PGND) U12.8(AGND) U12.13(PGND) U13.8(AGND) U13.13(PGND)
EN_3V3_OFF: Q12.1(G) R125.1
EN_12V_OFF: Q10.1(G) R105.1
EN_12VFAN_OFF: Q11.1(G) R112.1
LV_3V3_BST: C134.1 U13.4(BOOT)
LV_3V3_EN: Q12.3(D) R123.2 R124.1 U13.9(EN)
LV_3V3_FB: C138.2 R120.2 R121.1 U13.7(FB)
LV_3V3_FF: C138.1 R122.2
LV_3V3_PRE: C135.1 C136.1 C137.1 C139.1 L13.2 R120.1 R122.1
LV_3V3_SW: C134.2 L13.1 U13.1(SW) U13.2(SW) U13.3(SW)
LV_5V_BST: C124.1 U12.4(BOOT)
LV_5V_EN: R117.2 R118.1 U12.9(EN)
LV_5V_FB: C128.2 R114.2 R115.1 U12.7(FB)
LV_5V_FF: C128.1 R116.2
LV_5V_SW: C124.2 L12.1 U12.1(SW) U12.2(SW) U12.3(SW)
LV_12V_BST: C104.1 U10.4(BOOT)
LV_12V_EN: Q10.3(D) R103.2 R104.1 U10.9(EN)
LV_12V_FB: C108.2 R100.2 R101.1 U10.7(FB)
LV_12V_FF: C108.1 R102.2
LV_12V_PRE: C105.1 C106.1 C107.1 L10.2 R100.1 R102.1
LV_12V_SW: C104.2 L10.1 U10.1(SW) U10.2(SW) U10.3(SW)
LV_12VF_BST: C114.1 U11.4(BOOT)
LV_12VF_EN: Q11.3(D) R110.2 R111.1 U11.9(EN)
LV_12VF_FB: C118.2 R107.2 R108.1 U11.7(FB)
LV_12VF_FF: C118.1 R109.2
LV_12VF_PRE: C115.1 C116.1 C117.1 L11.2 R107.1 R109.1
LV_12VF_SW: C114.2 L11.1 U11.1(SW) U11.2(SW) U11.3(SW)

Not connected (* = marked no-connect by the designer): U10 5(PG)* 6(RT)*; U11 5(PG)* 6(RT)*; U12 5(PG)* 6(RT)*; U13 5(PG)* 6(RT)*

### Notes on the sheet
- DWG NO:
- REV:
- THIS DOCUMENT AND THE DATA DISCLOSED HEREIN OR
- HEREWITH IS THE PROPERTY OF ALTIUM LIMITED AND MAY
- BE FREELY DISTRIBUTED IN WHOLE. NO RIGHTS ARE
- RESERVED OR EXPRESS OR IMPLIED WARANTEE GIVEN.
- SHEET 2/5  BUCKS FROM +24V_BUS: 12V / 12V_FAN / 5V / 3V3_OUT
- REVISION
- DESCRIPTION
- DATE
- APPROVED
- ENG:
- APPROVALS
- PROJECT
- DSN:
- CHK:
- REFERENCE DOCUMENTS
- PROJECT REVISION:
- TITLE
- DOCUMENT REVISION:
- DESIGN ITEM:
- BOM:
- FAB DWG:
- PCB DWG:
- ASSY DWG:
- SCALE:
- A2
- SIZE
- CAGE CODE
- FILE NAME
- DWG NO.
- SHEET
- OF
- REV

### Library data of the parts
C100-C102 C110-C112 C120-C122 C130-C132 = C_10U_1206: as C6 on sheet PowerPanel_1_Mains_24V_48V; Value: 10U; LCSC: C13585; JLC_TYPE: BASIC; JLC_CHECKED: 2026-09-29 STOCK 2442079; Datasheet: https://www.lcsc.com/datasheet/lcsc_datasheet_2304140030_Samsung-Electro-Mechanics-CL31A106KBHNNNE_C13585.pdf
C103 C104 C113 C114 C123 C124 C133 C134 = C_100N_0603: as C2 on sheet PowerPanel_1_Mains_24V_48V; Value: 100N; LCSC: C14663; JLC_TYPE: BASIC; JLC_CHECKED: 2026-09-29 STOCK 55887132; Datasheet: https://www.lcsc.com/datasheet/lcsc_datasheet_2211101700_YAGEO-CC0603KRX7R9BB104_C14663.pdf
C105-C107 C115-C117 = C_22U_1206: CAP // 22U // 25V // X5R // 1206; MFR: Samsung Electro-Mechanics; MPN: CL31A226KAHNNNE; Value: 22U; LCSC: C12891; JLC_TYPE: BASIC; JLC_CHECKED: 2026-10-03 STOCK 585151; Datasheet: https://www.lcsc.com/datasheet/lcsc_datasheet_2304140030_Samsung-Electro-Mechanics-CL31A226KAHNNNE_C12891.pdf
C108 C118 C128 C138 = C_33P_0603: CAP // 33P // 50V // C0G // 0603; MFR: Samsung Electro-Mechanics; MPN: CL10C330JB8NNNC; Value: 33P; LCSC: C1663; JLC_TYPE: BASIC; JLC_CHECKED: 2026-10-03 STOCK 1028975; Datasheet: https://www.lcsc.com/datasheet/lcsc_datasheet_2304140030_Samsung-Electro-Mechanics-CL10C330JB8NNNC_C1663.pdf
C125-C127 C135-C137 = C_47U_1206: CAP // 47U // 10V // X5R // 1206; MFR: Samsung Electro-Mechanics; MPN: CL31A476MPHNNNE; Value: 47U; LCSC: C96123; JLC_TYPE: BASIC; JLC_CHECKED: 2026-09-29 STOCK 316228; Datasheet: https://www.lcsc.com/datasheet/lcsc_datasheet_2304140030_Samsung-Electro-Mechanics-CL31A476MPHNNNE_C96123.pdf
C139 = C_22U_0805: CAP // 22U // 25V // X5R // 0805; MFR: Samsung Electro-Mechanics; MPN: CL21A226MAQNNNE; Value: 22U; LCSC: C45783; JLC_TYPE: BASIC; JLC_CHECKED: 2026-09-29 STOCK 4065880; Datasheet: https://www.lcsc.com/datasheet/lcsc_datasheet_2304140030_Samsung-Electro-Mechanics-CL21A226MAQNNNE_C45783.pdf
C155-C158 = CP_47U_100V_8X10: as C21 on sheet PowerPanel_1_Mains_24V_48V; Value: 47U; LCSC: C48935391; JLC_TYPE: EXTENDED; JLC_CHECKED: 2026-10-03 STOCK 115676; Datasheet: https://www.lcsc.com/datasheet/lcsc_datasheet_2505151725_jieerrui-RV100V47M8X10_C48935391.pdf
L10 L11 = L_6U8_1040: IND // 6U8 // ISAT 9.6A // IRMS 7A // 25MR // 1040 MOLDED; MFR: cjiang (Changjiang Microelectronics Tech); MPN: FXL1040-6R8-M; Value: 6U8; LCSC: C167231; JLC_TYPE: EXTENDED; JLC_CHECKED: 2026-10-03 STOCK 13168; Datasheet: https://www.lcsc.com/datasheet/lcsc_datasheet_2404260921_cjiang--Changjiang-Microelectronics-Tech-FXL1040-6R8-M_C167231.pdf
L12 = L_4U7_1040: IND // 4U7 // ISAT 10.4A // IRMS 7.5A // 20MR // 1040 MOLDED; MFR: cjiang (Changjiang Microelectronics Tech); MPN: FXL1040-4R7-M; Value: 4U7; LCSC: C167230; JLC_TYPE: EXTENDED; JLC_CHECKED: 2026-10-03 STOCK 4281; Datasheet: https://www.lcsc.com/datasheet/lcsc_datasheet_2404260921_cjiang--Changjiang-Microelectronics-Tech-FXL1040-4R7-M_C167230.pdf
L13 = L_3U3_1040: IND // 3U3 // ISAT 12.8A // IRMS 9.5A // 11.8MR // 1040 MOLDED; MFR: cjiang (Changjiang Microelectronics Tech); MPN: FXL1040-3R3-M; Value: 3U3; LCSC: C167229; JLC_TYPE: EXTENDED; JLC_CHECKED: 2026-10-03 STOCK 5757; Datasheet: https://www.lcsc.com/datasheet/lcsc_datasheet_2404260921_cjiang--Changjiang-Microelectronics-Tech-FXL1040-3R3-M_C167229.pdf
Q10-Q12 = Q_2N7002: as Q3 on sheet PowerPanel_1_Mains_24V_48V; Value: 2N7002; MPN: 2N7002; LCSC: C8545; JLC_TYPE: BASIC; JLC_CHECKED: 2026-09-29 STOCK 1679919; Datasheet: https://www.lcsc.com/datasheet/lcsc_datasheet_2304140030_Jiangsu-Changjing-Electronics-Technology-Co---Ltd--2N7002_C8545.pdf
R100 R103 R105 R107 R110 R112 R114 R117 R120 R123 R125 = R_100K_0603: as R6 on sheet PowerPanel_1_Mains_24V_48V; Value: 100K; LCSC: C25803; JLC_TYPE: BASIC; JLC_CHECKED: 2026-09-29 STOCK 22429301; Datasheet: https://www.lcsc.com/datasheet/lcsc_datasheet_2206010045_UNI-ROYAL-Uniroyal-Elec-0603WAF1003T5E_C25803.pdf
R101 R108 = R_7K15_0603: RES // 7K15 // 1% // 100MW // 0603; MFR: UNI-ROYAL(Uniroyal Elec); MPN: 0603WAF7151T5E; Value: 7K15; LCSC: C25980; JLC_TYPE: EXTENDED; JLC_CHECKED: 2026-10-03 STOCK 8144; Datasheet: https://www.lcsc.com/datasheet/lcsc_datasheet_2206010045_UNI-ROYAL-Uniroyal-Elec-0603WAF7151T5E_C25980.pdf
R102 R109 R116 R122 = R_1K_0603: RES // 1K // 1% // 100MW // 0603; MFR: UNI-ROYAL(Uniroyal Elec); MPN: 0603WAF1001T5E; Value: 1K; LCSC: C21190; JLC_TYPE: BASIC; JLC_CHECKED: 2026-09-29 STOCK 22360355; Datasheet: https://www.lcsc.com/datasheet/lcsc_datasheet_2206010130_UNI-ROYAL-Uniroyal-Elec-0603WAF1001T5E_C21190.pdf
R104 R111 R118 R124 = R_10K_0603: as R12 on sheet PowerPanel_1_Mains_24V_48V; Value: 10K; LCSC: C25804; JLC_TYPE: BASIC; JLC_CHECKED: 2026-09-29 STOCK 21309815; Datasheet: https://www.lcsc.com/datasheet/lcsc_datasheet_2206010045_UNI-ROYAL-Uniroyal-Elec-0603WAF1002T5E_C25804.pdf
R115 = R_19K1_0603: as R21 on sheet PowerPanel_1_Mains_24V_48V; Value: 19K1; LCSC: C22897; JLC_TYPE: EXTENDED; JLC_CHECKED: 2026-10-03 STOCK 64956; Datasheet: https://www.lcsc.com/datasheet/lcsc_datasheet_2206010130_UNI-ROYAL-Uniroyal-Elec-0603WAF1912T5E_C22897.pdf
R121 = R_31K6_0603: RES // 31K6 // 1% // 100MW // 0603; MFR: UNI-ROYAL(Uniroyal Elec); MPN: 0603WAF3162T5E; Value: 31K6; LCSC: C25967; JLC_TYPE: EXTENDED; JLC_CHECKED: 2026-10-03 STOCK 116347; Datasheet: https://www.lcsc.com/datasheet/lcsc_datasheet_2206010045_UNI-ROYAL-Uniroyal-Elec-0603WAF3162T5E_C25967.pdf
TP6 TP35 = TP: as TP1 on sheet PowerPanel_1_Mains_24V_48V
U10-U13 = U_LMR51450: BUCK // 4V-36V IN // 5A // 500KHZ // SYNC PFM // WSON-12; MFR: Texas Instruments; MPN: LMR51450SDRRR; Value: LMR51450; LCSC: C6890985; JLC_TYPE: EXTENDED; JLC_CHECKED: 2026-10-03 STOCK 16947; Datasheet: https://wmsc.lcsc.com/wmsc/upload/file/pdf/v2/lcsc/2402291910_Texas-Instruments-LMR51450SDRRR_C6890985.pdf

## Sheet PowerPanel_3_LowV_Monitors.SchDoc
size 594 x 420 mm; SheetNumber: 4; SheetTotal: 6
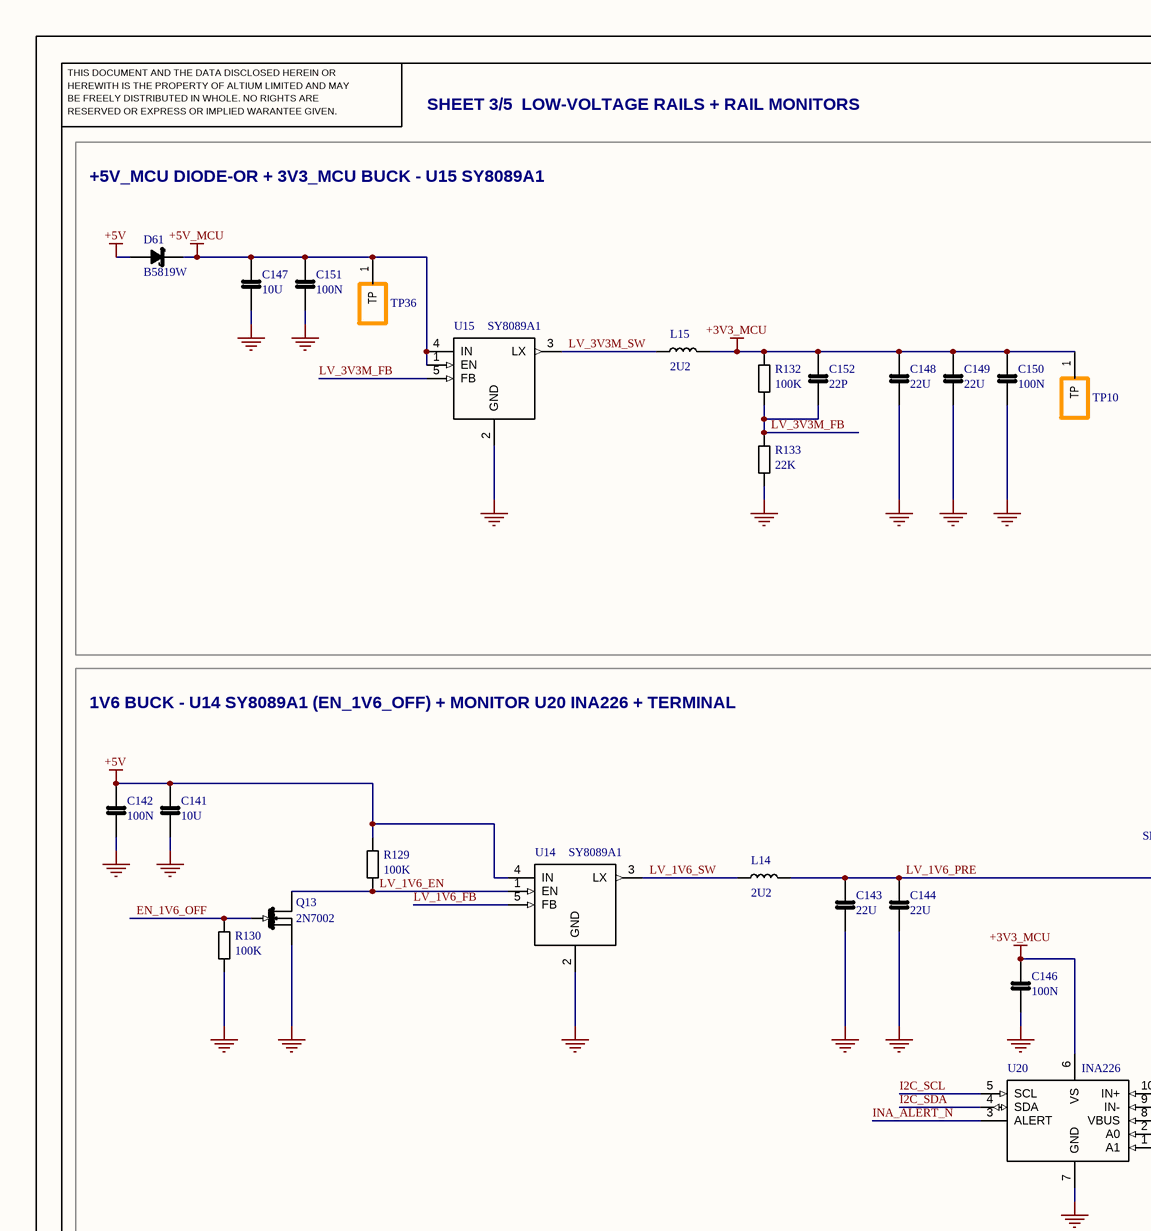
[diagram p11: PowerPanel_3_LowV_Monitors.SchDoc, top left]
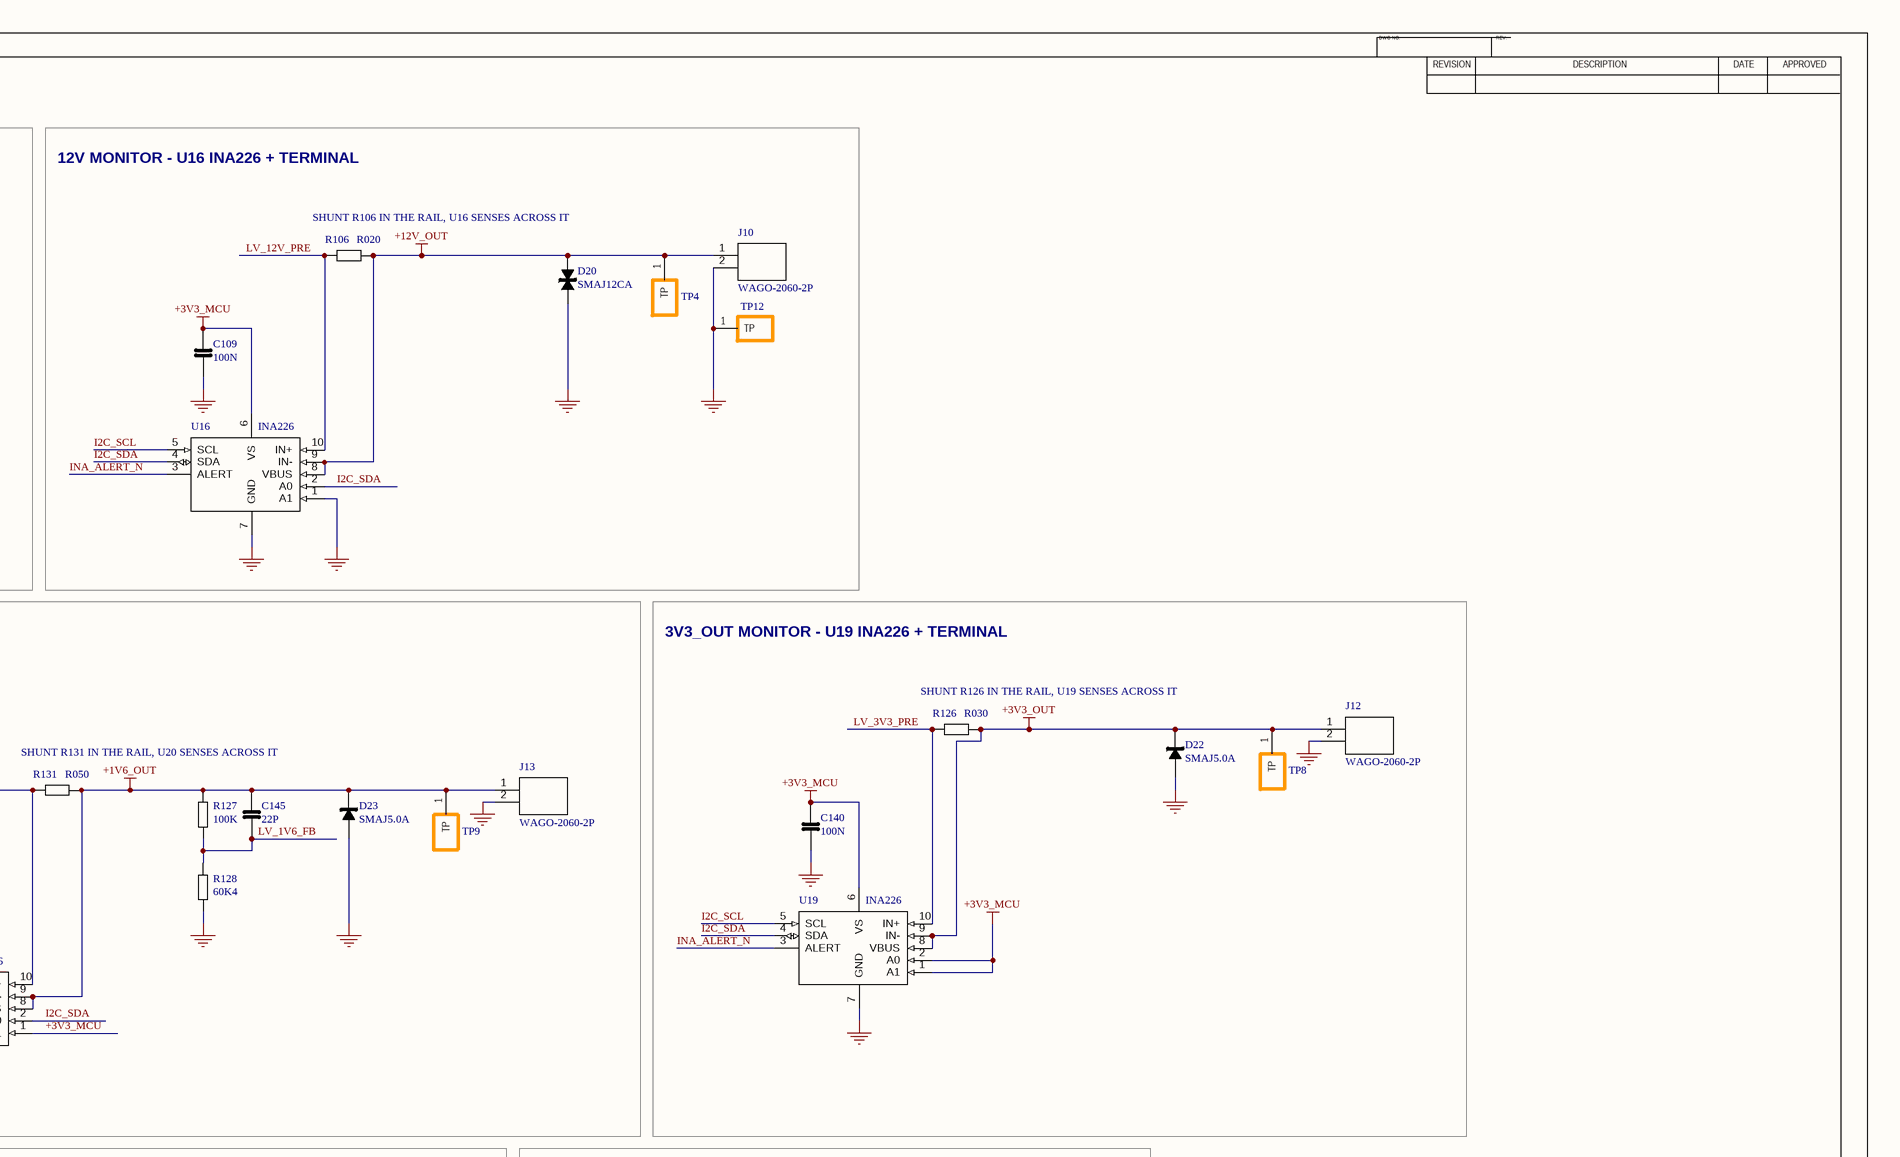
[diagram p12: PowerPanel_3_LowV_Monitors.SchDoc, top right]
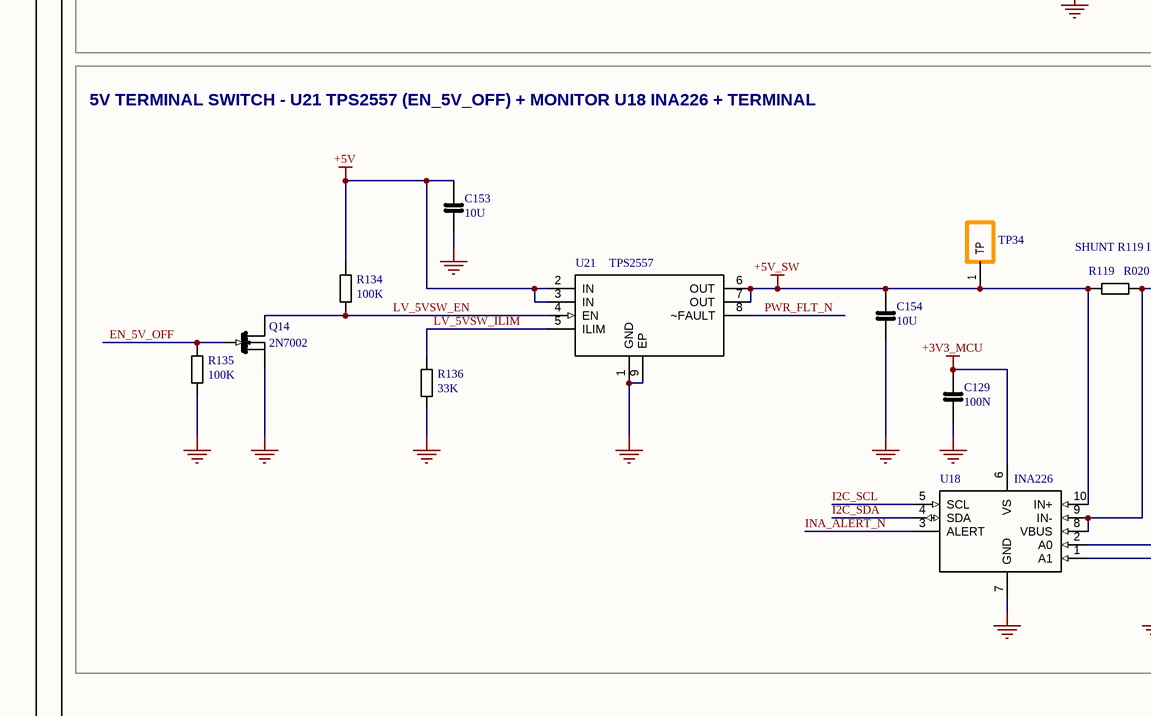
[diagram p13: PowerPanel_3_LowV_Monitors.SchDoc, bottom left]
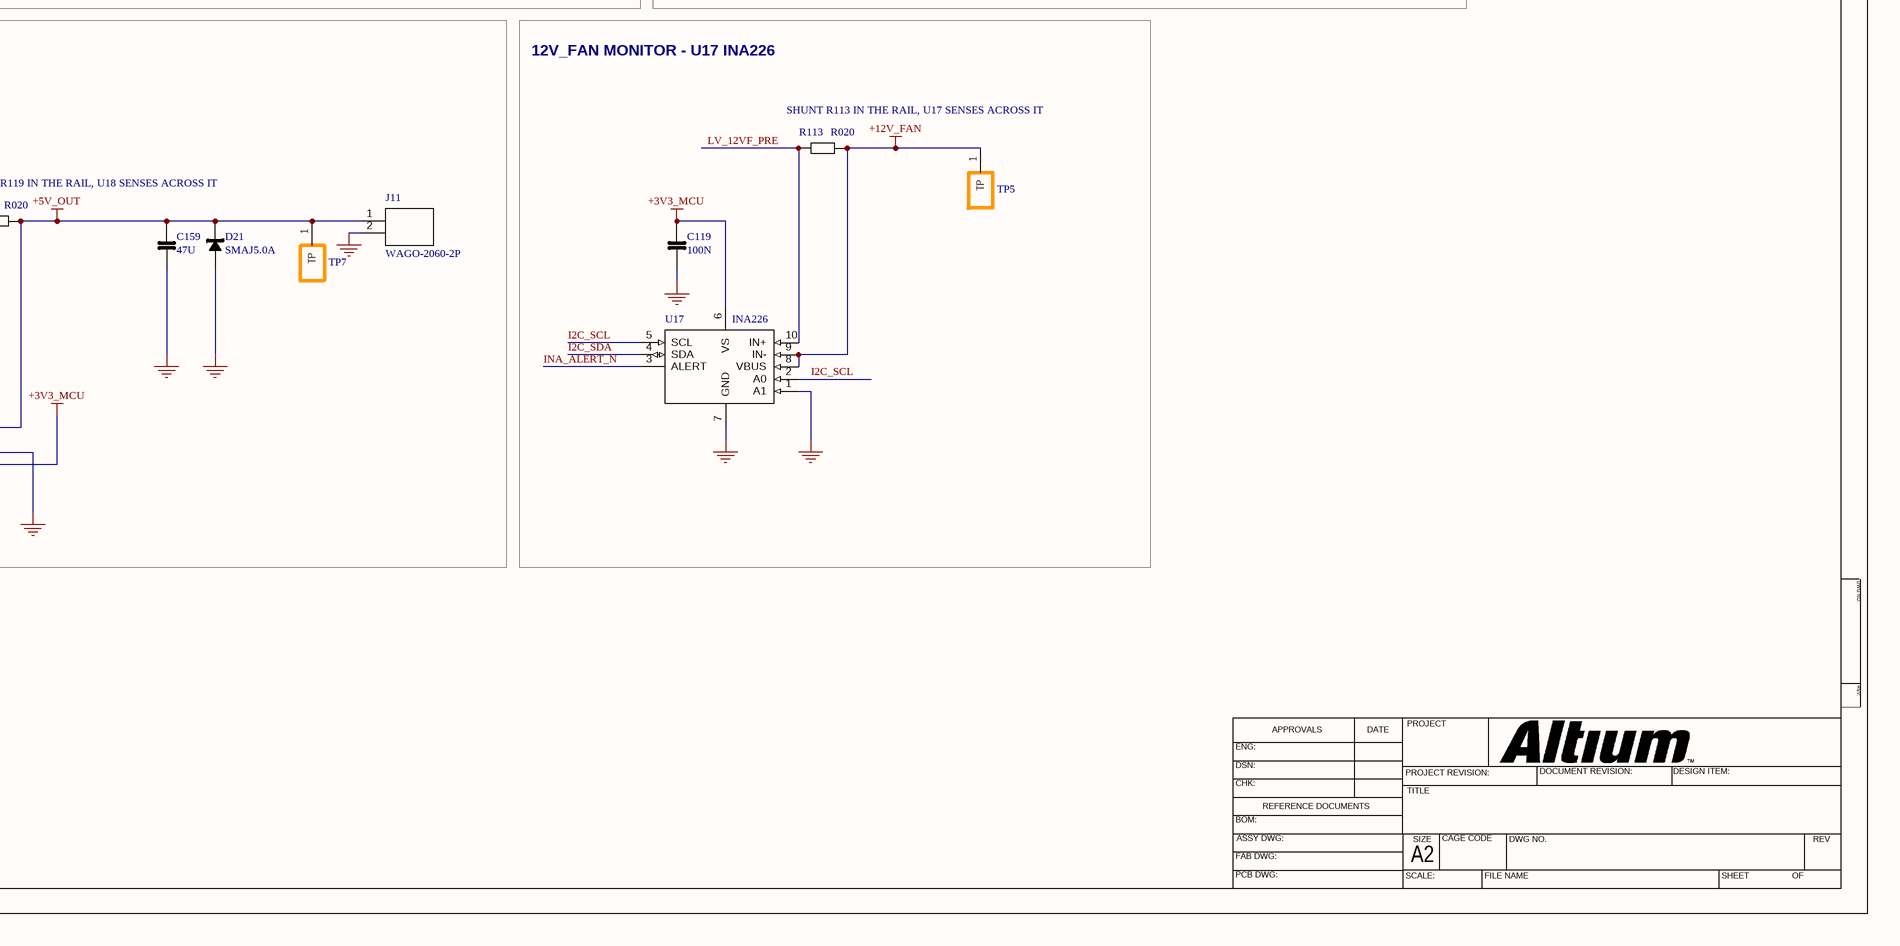
[diagram p14: PowerPanel_3_LowV_Monitors.SchDoc, bottom right]

### Parts
C109  100N  [CAP0603]
C119  100N  [CAP0603]
C129  100N  [CAP0603]
C140  100N  [CAP0603]
C141  10U  [CAP0805]
C142  100N  [CAP0603]
C143  22U  [CAP0805]
C144  22U  [CAP0805]
C145  22P  [CAP0603]
C146  100N  [CAP0603]
C147  10U  [CAP0805]
C148  22U  [CAP0805]
C149  22U  [CAP0805]
C150  100N  [CAP0603]
C151  100N  [CAP0603]
C152  22P  [CAP0603]
C153  10U  [CAP0805]
C154  10U  [CAP0805]
C159  47U  [CAP1206]
D20  SMAJ12CA  [SMA]
D21  SMAJ5.0A  [SMA]
D22  SMAJ5.0A  [SMA]
D23  SMAJ5.0A  [SMA]
D61  B5819W  [SOD-123]
J10  WAGO-2060-2P  [TERM_WAGO_2060-452]
J11  WAGO-2060-2P  [TERM_WAGO_2060-452]
J12  WAGO-2060-2P  [TERM_WAGO_2060-452]
J13  WAGO-2060-2P  [TERM_WAGO_2060-452]
L14  2U2  [L_4030]
L15  2U2  [L_4030]
Q13  2N7002  [SOT-23-3]
Q14  2N7002  [SOT-23-3]
R106  R020  [R1206]
R113  R020  [R1206]
R119  R020  [R1206]
R126  R030  [R1206]
R127  100K  [R0603]
R128  60K4  [R0603]
R129  100K  [R0603]
R130  100K  [R0603]
R131  R050  [R1206]
R132  100K  [R0603]
R133  22K  [R0603]
R134  100K  [R0603]
R135  100K  [R0603]
R136  33K  [R0603]
TP4  TP  [TESTPOINT]  (value not drawn)
TP5  TP  [TESTPOINT]  (value not drawn)
TP7  TP  [TESTPOINT]  (value not drawn)
TP8  TP  [TESTPOINT]  (value not drawn)
TP9  TP  [TESTPOINT]  (value not drawn)
TP10  TP  [TESTPOINT]  (value not drawn)
TP12  TP  [TESTPOINT]  (value not drawn)
TP34  TP  [TESTPOINT]  (value not drawn)
TP36  TP  [TESTPOINT]  (value not drawn)
U14  SY8089A1  [SOT-23-5]
U15  SY8089A1  [SOT-23-5]
U16  INA226  [MSOP-10]
U17  INA226  [MSOP-10]
U18  INA226  [MSOP-10]
U19  INA226  [MSOP-10]
U20  INA226  [MSOP-10]
U21  TPS2557  [VSON-8_3X3_EP]

### Blocks framed on the sheet
+5V_MCU DIODE-OR + 3V3_MCU BUCK - U15 SY8089A1: C147-C152 D61 L15 R132 R133 TP10 TP36 U15
12V MONITOR - U16 INA226 + TERMINAL: C109 D20 J10 R106 TP4 TP12 U16
SHUNT R131 IN THE RAIL, U20 SENSES ACROSS IT: C141-C146 D23 J13 L14 Q13 R127-R131 TP9 U14 U20
3V3_OUT MONITOR - U19 INA226 + TERMINAL: C140 D22 J12 R126 TP8 U19
SHUNT R119 IN THE RAIL, U18 SENSES ACROSS IT: C129 C153 C154 C159 D21 J11 Q14 R119 R134-R136 TP7 TP34 U18 U21
12V_FAN MONITOR - U17 INA226: C119 R113 TP5 U17

### Nets
+1V6_OUT: C145.1 D23.1(K) J13.1 R127.1 R131.2 TP9.1(TP) U20.8(VBUS) U20.9(IN-)
+3V3_MCU: C109.1 C119.1 C129.1 C140.1 C146.1 C148.1 C149.1 C150.1 C152.1 L15.2 R132.1 TP10.1(TP) U16.6(VS) U17.6(VS) U18.1(A1) U18.6(VS) U19.1(A1) U19.2(A0) U19.6(VS) U20.1(A1) U20.6(VS)
+3V3_OUT: D22.1(K) J12.1 R126.2 TP8.1(TP) U19.8(VBUS) U19.9(IN-)
+5V: C141.1 C142.1 C153.1 D61.2(A) R129.1 R134.1 U14.4(IN) U21.2(IN) U21.3(IN)
+5V_MCU: C147.1 C151.1 D61.1(K) TP36.1(TP) U15.1(EN) U15.4(IN)
+5V_OUT: C159.1 D21.1(K) J11.1 R119.2 TP7.1(TP) U18.8(VBUS) U18.9(IN-)
+5V_SW: C154.1 R119.1 TP34.1(TP) U18.10(IN+) U21.6(OUT) U21.7(OUT)
+12V_FAN: R113.2 TP5.1(TP) U17.8(VBUS) U17.9(IN-)
+12V_OUT: D20.1 J10.1 R106.2 TP4.1(TP) U16.8(VBUS) U16.9(IN-)
GND: C109.2 C119.2 C129.2 C140.2 C141.2 C142.2 C143.2 C144.2 C146.2 C147.2 C148.2 C149.2 C150.2 C151.2 C153.2 C154.2 C159.2 D20.2 D21.2(A) D22.2(A) D23.2(A) J10.2 J11.2 J12.2 J13.2 Q13.2(S) Q14.2(S) R128.2 R130.2 R133.2 R135.2 R136.2 TP12.1(TP) U14.2(GND) U15.2(GND) U16.1(A1) U16.7(GND) U17.1(A1) U17.7(GND) U18.2(A0) U18.7(GND) U19.7(GND) U20.7(GND) U21.1(GND) U21.9(EP)
EN_1V6_OFF: Q13.1(G) R130.1
EN_5V_OFF: Q14.1(G) R135.1
I2C_SCL: U16.5(SCL) U17.2(A0) U17.5(SCL) U18.5(SCL) U19.5(SCL) U20.5(SCL)
I2C_SDA: U16.2(A0) U16.4(SDA) U17.4(SDA) U18.4(SDA) U19.4(SDA) U20.2(A0) U20.4(SDA)
INA_ALERT_N: U16.3(ALERT) U17.3(ALERT) U18.3(ALERT) U19.3(ALERT) U20.3(ALERT)
LV_1V6_EN: Q13.3(D) R129.2 U14.1(EN)
LV_1V6_FB: C145.2 R127.2 R128.1 U14.5(FB)
LV_1V6_PRE: C143.1 C144.1 L14.2 R131.1 U20.10(IN+)
LV_1V6_SW: L14.1 U14.3(LX)
LV_3V3_PRE: R126.1 U19.10(IN+)
LV_3V3M_FB: C152.2 R132.2 R133.1 U15.5(FB)
LV_3V3M_SW: L15.1 U15.3(LX)
LV_5VSW_EN: Q14.3(D) R134.2 U21.4(EN)
LV_5VSW_ILIM: R136.1 U21.5(ILIM)
LV_12V_PRE: R106.1 U16.10(IN+)
LV_12VF_PRE: R113.1 U17.10(IN+)
PWR_FLT_N: U21.8(~FAULT)

### Notes on the sheet
- DWG NO:
- REV:
- THIS DOCUMENT AND THE DATA DISCLOSED HEREIN OR
- HEREWITH IS THE PROPERTY OF ALTIUM LIMITED AND MAY
- BE FREELY DISTRIBUTED IN WHOLE. NO RIGHTS ARE
- RESERVED OR EXPRESS OR IMPLIED WARANTEE GIVEN.
- SHEET 3/5  LOW-VOLTAGE RAILS + RAIL MONITORS
- REVISION
- DESCRIPTION
- DATE
- APPROVED
- SHUNT R106 IN THE RAIL, U16 SENSES ACROSS IT
- 1V6 BUCK - U14 SY8089A1 (EN_1V6_OFF) + MONITOR U20 INA226 + TERMINAL
- (near R126) SHUNT R126 IN THE RAIL, U19 SENSES ACROSS IT
- 5V TERMINAL SWITCH - U21 TPS2557 (EN_5V_OFF) + MONITOR U18 INA226 + TERMINAL
- (near R113) SHUNT R113 IN THE RAIL, U17 SENSES ACROSS IT
- ENG:
- APPROVALS
- PROJECT
- DSN:
- CHK:
- REFERENCE DOCUMENTS
- PROJECT REVISION:
- TITLE
- DOCUMENT REVISION:
- DESIGN ITEM:
- BOM:
- FAB DWG:
- PCB DWG:
- ASSY DWG:
- SCALE:
- A2
- SIZE
- CAGE CODE
- FILE NAME
- DWG NO.
- SHEET
- OF
- REV

### Library data of the parts
C109 C119 C129 C140 C142 C146 C150 C151 = C_100N_0603: as C2 on sheet PowerPanel_1_Mains_24V_48V; Value: 100N; LCSC: C14663; JLC_TYPE: BASIC; JLC_CHECKED: 2026-09-29 STOCK 55887132; Datasheet: https://www.lcsc.com/datasheet/lcsc_datasheet_2211101700_YAGEO-CC0603KRX7R9BB104_C14663.pdf
C141 C147 C153 C154 = C_10U_0805: CAP // 10U // 25V // X5R // 0805; MFR: Samsung Electro-Mechanics; MPN: CL21A106KAYNNNE; Value: 10U; LCSC: C15850; JLC_TYPE: BASIC; JLC_CHECKED: 2026-09-29 STOCK 5145754; Datasheet: https://www.lcsc.com/datasheet/lcsc_datasheet_2304140030_Samsung-Electro-Mechanics-CL21A106KAYNNNE_C15850.pdf
C143 C144 C148 C149 = C_22U_0805: as C139 on sheet PowerPanel_2_Bucks; Value: 22U; LCSC: C45783; JLC_TYPE: BASIC; JLC_CHECKED: 2026-09-29 STOCK 4065880; Datasheet: https://www.lcsc.com/datasheet/lcsc_datasheet_2304140030_Samsung-Electro-Mechanics-CL21A226MAQNNNE_C45783.pdf
C145 C152 = C_22P_0603: CAP // 22P // 50V // C0G // 0603; MFR: Samsung Electro-Mechanics; MPN: CL10C220JB8NNNC; Value: 22P; LCSC: C1653; JLC_TYPE: BASIC; JLC_CHECKED: 2026-09-29 STOCK 3038075; Datasheet: https://www.lcsc.com/datasheet/lcsc_datasheet_2304140030_Samsung-Electro-Mechanics-CL10C220JB8NNNC_C1653.pdf
C159 = C_47U_1206: as C125 on sheet PowerPanel_2_Bucks; Value: 47U; LCSC: C96123; JLC_TYPE: BASIC; JLC_CHECKED: 2026-09-29 STOCK 316228; Datasheet: https://www.lcsc.com/datasheet/lcsc_datasheet_2304140030_Samsung-Electro-Mechanics-CL31A476MPHNNNE_C96123.pdf
D20 = D_SMAJ12CA: TVS // 12V BI // 400W // 19V9 CLAMP // SMA; MFR: hongjiacheng; Value: 12V; MPN: SMAJ12CA; LCSC: C19077532; JLC_TYPE: PREFERRED; JLC_CHECKED: 2026-09-29 STOCK 274481; Datasheet: https://wmsc.lcsc.com/wmsc/upload/file/pdf/v2/lcsc/2403232245_hongjiacheng-SMAJ12CA_C19077532.pdf
D21-D23 = D_SMAJ5V0A: TVS // 5V0 UNI // 400W // 9V2 CLAMP // SMA; MFR: hongjiacheng; Value: 5V0; MPN: SMAJ5.0A; LCSC: C19077523; JLC_TYPE: PREFERRED; JLC_CHECKED: 2026-09-29 STOCK 321801; Datasheet: https://wmsc.lcsc.com/wmsc/upload/file/pdf/v2/lcsc/2312041002_hongjiacheng-SMAJ5-0A_C19077523.pdf
D61 = D_B5819W: SCHOTTKY // 40V 1A // 600MV // SOD-123; MFR: Jiangsu Changjing Electronics Technology Co., Ltd.; MPN: B5819W SL; Value: B5819W; LCSC: C8598; JLC_TYPE: BASIC; JLC_CHECKED: 2026-09-29 STOCK 545116; Datasheet: https://www.lcsc.com/datasheet/lcsc_datasheet_2304140030_Jiangsu-Changjing-Electronics-Technology-Co---Ltd--B5819W-SL_C8598.pdf
J10-J13 = J_TERM-SPRING_2P_4.0_SMD: as J2 on sheet PowerPanel_1_Mains_24V_48V; Value: 2P; MFR: WAGO; LCSC: C2765055; JLC_TYPE: EXTENDED; JLC_CHECKED: 2026-10-03 STOCK 27983; Datasheet: https://wmsc.lcsc.com/wmsc/upload/file/pdf/v2/lcsc/2410121253_WAGO-2060-452-998-404_C2765055.pdf
L14 L15 = L_2U2_4030: IND // 2U2 // ISAT 4.9A // IRMS 2.95A // 39MR // 4030 SHIELDED; MFR: cjiang (Changjiang Microelectronics Tech); MPN: FNR4030S2R2MT; Value: 2U2; LCSC: C167869; JLC_TYPE: EXTENDED; JLC_CHECKED: 2026-09-29 STOCK 67195; Datasheet: https://www.lcsc.com/datasheet/lcsc_datasheet_2304140030_cjiang--Changjiang-Microelectronics-Tech-FNR4030S2R2MT_C167869.pdf
Q13 Q14 = Q_2N7002: as Q3 on sheet PowerPanel_1_Mains_24V_48V; Value: 2N7002; MPN: 2N7002; LCSC: C8545; JLC_TYPE: BASIC; JLC_CHECKED: 2026-09-29 STOCK 1679919; Datasheet: https://www.lcsc.com/datasheet/lcsc_datasheet_2304140030_Jiangsu-Changjing-Electronics-Technology-Co---Ltd--2N7002_C8545.pdf
R106 R113 R119 = R_R020_1206: as R1 on sheet PowerPanel_1_Mains_24V_48V; Value: R020; LCSC: C371097; JLC_TYPE: EXTENDED; JLC_CHECKED: 2026-10-03 STOCK 16724; Datasheet: https://www.lcsc.com/datasheet/lcsc_datasheet_2304140030_PSA-Prosperity-Dielectrics-FMF06FTHR020-LH_C371097.pdf
R126 = R_R030_1206: SHUNT // R030 // 1% // 1W // 50PPM // 1206; MFR: Milliohm; MPN: HoYLR1206-1W-30mR-1%; Value: R030; LCSC: C5375399; JLC_TYPE: EXTENDED; JLC_CHECKED: 2026-10-03 STOCK 84887; Datasheet: https://wmsc.lcsc.com/wmsc/upload/file/pdf/v2/lcsc/2305061708_Milliohm-HoYLR1206-1W-40mR-1-_C5375400.pdf
R127 R129 R130 R132 R134 R135 = R_100K_0603: as R6 on sheet PowerPanel_1_Mains_24V_48V; Value: 100K; LCSC: C25803; JLC_TYPE: BASIC; JLC_CHECKED: 2026-09-29 STOCK 22429301; Datasheet: https://www.lcsc.com/datasheet/lcsc_datasheet_2206010045_UNI-ROYAL-Uniroyal-Elec-0603WAF1003T5E_C25803.pdf
R128 = R_60K4_0603: RES // 60K4 // 1% // 100MW // 0603; MFR: UNI-ROYAL(Uniroyal Elec); MPN: 0603WAF6042T5E; Value: 60K4; LCSC: C23089; JLC_TYPE: EXTENDED; JLC_CHECKED: 2026-10-03 STOCK 92785; Datasheet: https://www.lcsc.com/datasheet/lcsc_datasheet_2206010116_UNI-ROYAL-Uniroyal-Elec-0603WAF6042T5E_C23089.pdf
R131 = R_R050_1206: as R14 on sheet PowerPanel_1_Mains_24V_48V; Value: R050; LCSC: C20608719; JLC_TYPE: EXTENDED; JLC_CHECKED: 2026-09-29 STOCK 79173; Datasheet: https://wmsc.lcsc.com/wmsc/upload/file/pdf/v2/lcsc/2401171159_Shenzhen-Yezhan-Elec--YLRY06-1-50F_C20608719.pdf
R133 = R_22K_0603: RES // 22K // 1% // 100MW // 0603; MFR: UNI-ROYAL(Uniroyal Elec); MPN: 0603WAF2202T5E; Value: 22K; LCSC: C31850; JLC_TYPE: BASIC; JLC_CHECKED: 2026-09-29 STOCK 3737803; Datasheet: https://www.lcsc.com/datasheet/lcsc_datasheet_2206010030_UNI-ROYAL-Uniroyal-Elec-0603WAF2202T5E_C31850.pdf
R136 = R_33K_0603: as R8 on sheet PowerPanel_1_Mains_24V_48V; Value: 33K; LCSC: C4216; JLC_TYPE: BASIC; JLC_CHECKED: 2026-10-03 STOCK 3235651; Datasheet: https://www.lcsc.com/datasheet/lcsc_datasheet_2206010230_UNI-ROYAL-Uniroyal-Elec-0603WAF3302T5E_C4216.pdf
TP4 TP5 TP7-TP10 TP12 TP34 TP36 = TP: as TP1 on sheet PowerPanel_1_Mains_24V_48V
U14 U15 = U_SY8089A1AAC: BUCK // 2V5-5V5 IN // 2A // 1M5HZ // SYNC // SOT-23-5; MFR: Silergy Corp; Value: ADJ; MPN: SY8089A1AAC; LCSC: C479074; JLC_TYPE: EXTENDED; JLC_CHECKED: 2026-09-29 STOCK 103249; Datasheet: https://www.lcsc.com/datasheet/lcsc_datasheet_2001171834_Silergy-Corp-SY8089A1AAC_C479074.pdf
U16-U20 = U_INA226: as U1 on sheet PowerPanel_1_Mains_24V_48V; Value: INA226; LCSC: C49851; JLC_TYPE: EXTENDED; JLC_CHECKED: 2026-09-29 STOCK 48191; Datasheet: https://www.lcsc.com/datasheet/lcsc_datasheet_2312041157_Texas-Instruments-INA226AIDGSR_C49851.pdf
U21 = U_TPS2557DRB: PWR SWITCH // 2V5-6V5 // 5A ADJ ILIM // 22MR // VSON-8 3X3; MFR: Texas Instruments; MPN: TPS2557DRBR; Value: TPS2557; LCSC: C130056; JLC_TYPE: EXTENDED; JLC_CHECKED: 2026-10-03 STOCK 1935; Datasheet: https://www.ti.com/lit/ds/symlink/tps2557.pdf